# Altium project TSMCN16-Test-PCB-V1.PrjPcb (part 1 of 2)
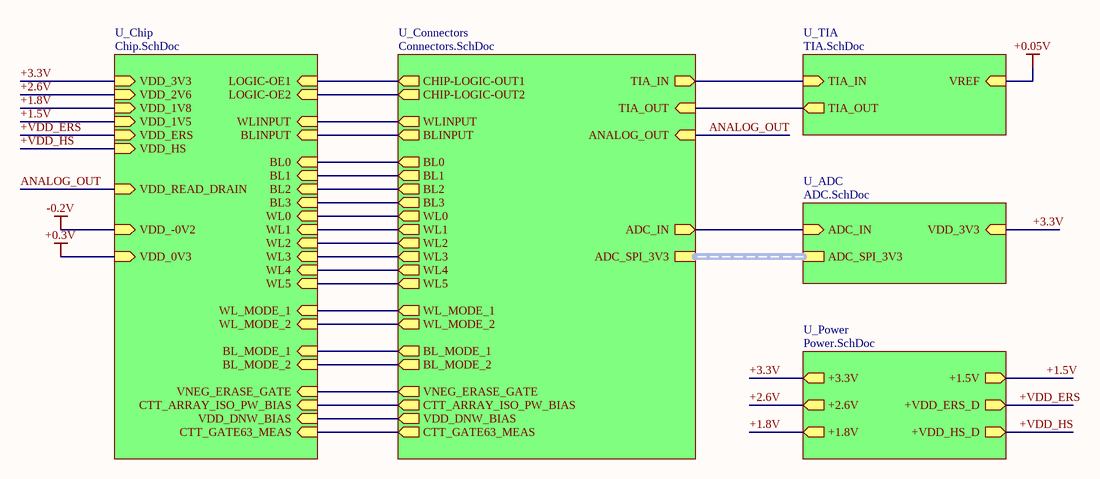
[diagram p0: Root.SchDoc]
CAGE_CODE: ?????; CONTRACT_NUMBER: <CONTRACT NO>; DOC_NO_ASSY_DWG: <ASSY DWG NO>; DOC_NO_BOM: <BOM DOC NO>; DOC_NO_FAB_DWG: <FAB DWG NO>; DOC_NO_SCH_DWG: <SCH DWG NO>; PCB_2_DEC_TOL: +/-.01; PCB_3_DEC_TOL: +/-.010; PCB_ANG_TOL: +/-1/2; PCB_ASSEMBLY_NO: <PCB ASSY NO>; PCB_CHECKER: - -----; PCB_CHECKER_APP_DATE: --/--/----; PCB_DESIGNER: - -----; PCB_DESIGNER_APP_DATE: --/--/----; PCB_DWG_NO: <PCB DWG NO>; PCB_ENGINEER: - -----; PCB_ENGINEER_APP_DATE: --/--/----; PCB_PART_NUMBER: <PCB PN>; PCB_REV: A; SCH_REV: A
8 sheets, 317 parts. Net scope: hierarchical (ports join the sheet entries above them; power ports are global).
Board file: PCB1.PcbDoc
Sheets:
  Root.SchDoc
    U_TIA = TIA.SchDoc
    U_Connectors = Connectors.SchDoc
    U_ADC = ADC.SchDoc
    U_Power = Power.SchDoc
      U_LDO = LDO.SchDoc
      U_LDO = LDO.SchDoc
      U_LDO = LDO.SchDoc
      U_LDO = LDO.SchDoc
      U_LDO = LDO.SchDoc
      U_LDO = LDO.SchDoc
    U_Chip = Chip.SchDoc
      U_ESD-0.8V = ESD-0.8V.SchDoc
      U_ESD-0.8V = ESD-0.8V.SchDoc
      U_ESD-0.8V = ESD-0.8V.SchDoc
      U_ESD-0.8V = ESD-0.8V.SchDoc

## Sheet Root.SchDoc
size A; SheetNumber: 1; SheetTotal: 8

### Sub-sheets
U_ADC = ADC.SchDoc: ADC_IN (in), VDD_3V3 (in), ADC_SPI_3V3 (harness ADC_SPI_3V3)
U_Chip = Chip.SchDoc: BL0 (in), BL1 (in), BL2 (in), BL3 (in), WL0 (in), WL1 (in), WL2 (in), WL3 (in), WL4 (in), WL5 (in), BL_MODE_2 (in), BL_MODE_1 (in), WL_MODE_2 (in), WL_MODE_1 (in), WLINPUT (in), BLINPUT (in), LOGIC-OE1 (in), LOGIC-OE2 (in), VDD_HS (in), VDD_ERS (in), VDD_1V5 (in), VDD_1V8 (in), VDD_2V6 (in), VDD_3V3 (in), VNEG_ERASE_GATE (in), CTT_ARRAY_ISO_PW_BIAS (in), CTT_GATE63_MEAS (in), VDD_DNW_BIAS (in), VDD_READ_DRAIN (in), VDD_-0V2 (in), VDD_0V3 (in)
U_Connectors = Connectors.SchDoc: BL0 (out), BL1 (out), WL0 (out), WL1 (out), WL2 (out), WL3 (out), WL4 (out), WL5 (out), BL2 (out), BL3 (out), BL_MODE_2 (out), BL_MODE_1 (out), WL_MODE_2 (out), WL_MODE_1 (out), TIA_IN (out), CHIP-LOGIC-OUT1 (out), CHIP-LOGIC-OUT2 (out), WLINPUT (out), BLINPUT (out), ADC_IN (out), TIA_OUT (in), ANALOG_OUT (in), VNEG_ERASE_GATE (out), CTT_ARRAY_ISO_PW_BIAS (out), CTT_GATE63_MEAS (out), VDD_DNW_BIAS (out), ADC_SPI_3V3 (harness ADC_SPI_3V3)
U_Power = Power.SchDoc: +1.5V (out), +1.8V (out), +2.6V (out), +3.3V (out), +VDD_ERS_D (out), +VDD_HS_D (out)
U_TIA = TIA.SchDoc: TIA_IN (in), VREF (in), TIA_OUT (out)

### Nets
+1.5V: sheet U_Power/+1.5V, sheet U_Chip/VDD_1V5
+1.8V: sheet U_Power/+1.8V, sheet U_Chip/VDD_1V8
+2.6V: sheet U_Power/+2.6V, sheet U_Chip/VDD_2V6
+3.3V: sheet U_ADC/VDD_3V3, sheet U_Power/+3.3V, sheet U_Chip/VDD_3V3
+VDD_ERS: sheet U_Power/+VDD_ERS_D, sheet U_Chip/VDD_ERS
+VDD_HS: sheet U_Power/+VDD_HS_D, sheet U_Chip/VDD_HS
ADC_IN: sheet U_Connectors/ADC_IN, sheet U_ADC/ADC_IN
ANALOG_OUT: sheet U_Connectors/ANALOG_OUT, sheet U_Chip/VDD_READ_DRAIN
VDD_DNW_B: sheet U_Connectors/VDD_DNW_BIAS, sheet U_Chip/VDD_DNW_BIAS
NetC1_1: sheet U_TIA/TIA_IN, sheet U_Connectors/TIA_IN
NetC20_2: sheet U_Connectors/CTT_ARRAY_ISO_PW_BIAS, sheet U_Chip/CTT_ARRAY_ISO_PW_BIAS
NetC44_2: sheet U_Connectors/VNEG_ERASE_GATE, sheet U_Chip/VNEG_ERASE_GATE
NetC50_2: sheet U_Connectors/CTT_GATE63_MEAS, sheet U_Chip/CTT_GATE63_MEAS
NetJ6_2: sheet U_Connectors/WLINPUT, sheet U_Chip/WLINPUT
NetJ6_4: sheet U_Connectors/BLINPUT, sheet U_Chip/BLINPUT
NetJ6_6: sheet U_Connectors/BL0, sheet U_Chip/BL0
NetJ6_8: sheet U_Connectors/BL1, sheet U_Chip/BL1
NetJ7_2: sheet U_Connectors/BL2, sheet U_Chip/BL2
NetJ7_4: sheet U_Connectors/BL3, sheet U_Chip/BL3
NetJ7_6: sheet U_Connectors/WL0, sheet U_Chip/WL0
NetJ7_8: sheet U_Connectors/WL1, sheet U_Chip/WL1
NetJ8_1: sheet U_Connectors/BL_MODE_2, sheet U_Chip/BL_MODE_2
NetJ8_3: sheet U_Connectors/BL_MODE_1, sheet U_Chip/BL_MODE_1
NetJ8_5: sheet U_Connectors/WL_MODE_2, sheet U_Chip/WL_MODE_2
NetJ8_7: sheet U_Connectors/WL_MODE_1, sheet U_Chip/WL_MODE_1
NetJ9_1: sheet U_Connectors/WL5, sheet U_Chip/WL5
NetJ9_3: sheet U_Connectors/WL4, sheet U_Chip/WL4
NetJ9_5: sheet U_Connectors/WL3, sheet U_Chip/WL3
NetJ9_7: sheet U_Connectors/WL2, sheet U_Chip/WL2
NetJ29_2: sheet U_TIA/TIA_OUT, sheet U_Connectors/TIA_OUT
NetJ30_1: sheet U_Connectors/CHIP-LOGIC-OUT1, sheet U_Chip/LOGIC-OE1
NetJ31_1: sheet U_Connectors/CHIP-LOGIC-OUT2, sheet U_Chip/LOGIC-OE2

### Buses and harness runs
harness sheet U_ADC/ADC_SPI_3V3 = sheet U_Connectors/ADC_SPI_3V3

## Sheet TIA.SchDoc
size A; SheetNumber: 2; SheetTotal: 8
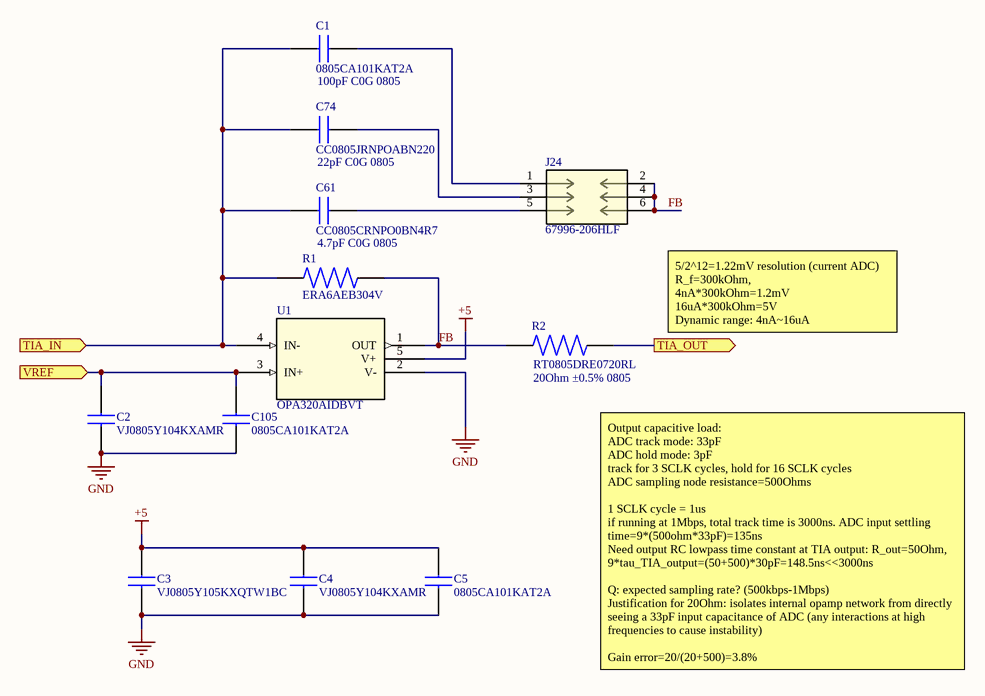
[diagram p1: TIA.SchDoc]

### Parts
C1  0805CA101KAT2A  [CAPC2112X94N]
C2  VJ0805Y104KXAMR  [CAPC2012X145N]
C3  VJ0805Y105KXQTW1BC  [CAPC2012X135N]
C4  VJ0805Y104KXAMR  [CAPC2012X145N]
C5  0805CA101KAT2A  [CAPC2112X94N]
C61  CC0805CRNPO0BN4R7  [CAP_CC0805_YAG]
C74  CC0805JRNPOABN220  [CAP_CC0805_YAG]
C105  0805CA101KAT2A  [CAPC2112X94N]
J24  67996-206HLF  [67996-206HLF_AMP]
R1  ERA6AEB304V  [RES_ERA6AEB304V]
R2  RT0805DRE0720RL  [RC0805N_YAG]
U1  OPA320AIDBVT  [DBV5]

### Ports
TIA_IN (in), TIA_OUT (out), VREF (in)

### Nets
+0.05V: C2.2 C105.2 U1.3(IN+) ; port VREF
+5: C3.2 C4.2 C5.2 U1.5(V+)  [project net VDD_5V]
GND: C2.1 C3.1 C4.1 C5.1 C105.1 U1.2(V-)  [project net CHIPS_VSS]
FB: J24.2 J24.4 J24.6 R1.2 R2.1 U1.1(OUT)
NetC1_1: C1.1 C61.1 C74.1 R1.1 U1.4(IN-) ; port TIA_IN
NetC1_2: C1.2 J24.1
NetC61_2: C61.2 J24.5
NetC74_2: C74.2 J24.3
NetJ29_2: R2.2 ; port TIA_OUT

### Notes on the sheet
- 100pF C0G 0805
- 22pF C0G 0805
- 4.7pF C0G 0805
- 5/2^12=1.22mV resolution (current ADC)
  R_f=300kOhm,
  4nA*300kOhm=1.2mV
  16uA*300kOhm=5V
  Dynamic range: 4nA~16uA
- (near R2) 20Ohm ±0.5% 0805
- Output capacitive load:
  ADC track mode: 33pF
  ADC hold mode: 3pF
  track for 3 SCLK cycles, hold for 16 SCLK cycles
  ADC sampling node resistance=500Ohms
  1 SCLK cycle = 1us
  if running at 1Mbps, total track time is 3000ns. ADC input settling time=9*(500ohm*33pF)=135ns
  Need output RC lowpass time constant at TIA output: R_out=50Ohm, 9*tau_TIA_output=(50+500)*30pF=148.5ns<<3000ns
  Q: expected sampling rate? (500kbps-1Mbps)
  Justification for 20Ohm: isolates internal opamp network from directly seeing a 33pF input capacitance of ADC (any interactions at high frequencies to cause instability)
  Gain error=20/(20+500)=3.8%

### Library data of the parts
C1 C5 C105 = 0805CA101KAT2A: 100 pF +/-10% 1000V (1kV) Ceramic Capacitor C0G, NP0 0805 (2012 Metric); Manufacturer_Name: Kyocera AVX; Geometry.Height: 0.94mm; Mouser Part Number: 581-0805CA101KAT2A; Mouser Price/Stock: https://www.mouser.co.uk/ProductDetail/KYOCERA-AVX/0805CA101KAT2A?qs=ZBeOGGPQgEHtR%2FQeWT8jmQ%3D%3D; Manufacturer_Part_Number: 0805CA101KAT2A; Datasheet Link: https://datasheets.kyocera-avx.com/AVX-HV_MLCC.pdf
C2 C4 = VJ0805Y104KXAMR: Multilayer Ceramic Capacitors MLCC - SMD/SMT 0805 0.1uF 50volts X7R 10%; Manufacturer_Name: Vishay; Geometry.Height: 1.45mm; Mouser Part Number: 77-VJ0805Y104KXAMR; Mouser Price/Stock: https://www.mouser.co.uk/ProductDetail/Vishay-Vitramon/VJ0805Y104KXAMR?qs=iPOr8XgPdiSpDWrmTedxnA%3D%3D; Manufacturer_Part_Number: VJ0805Y104KXAMR; Datasheet Link: http://www.vishay.com/docs/45226/vj31xrohsautomlcc.pdf
C3 = VJ0805Y105KXQTW1BC: 1 µF ±10% 10V Ceramic Capacitor X7R 0805 (2012 Metric); Manufacturer_Name: Vishay; Geometry.Height: 1.35mm; Mouser Part Number: 77-VJ0805Y105KXQTBC; Mouser Price/Stock: https://www.mouser.co.uk/ProductDetail/Vishay-Vitramon/VJ0805Y105KXQTW1BC?qs=F2lBERbFaaHnNHh23%2Flzkg%3D%3D; Manufacturer_Part_Number: VJ0805Y105KXQTW1BC; Datasheet Link: https://www.vishay.com/docs/28548/vjw1bcbascomseries.pdf
C61 = CC0805CRNPO0BN4R7: 4.7 pF ±0.25pF 100V Ceramic Capacitor C0G, NP0 0805 (2012 Metric); Manufacturer_Name: Yageo; Copyright: Copyright (C) 2026 Ultra Librarian. All rights reserved.; Manufacturer_Part_Number: CC0805CRNPO0BN4R7
C74 = CC0805JRNPOABN220: 22 pF ±5% 200V Ceramic Capacitor C0G, NP0 0805 (2012 Metric); Manufacturer_Name: Yageo; Copyright: Copyright (C) 2026 Ultra Librarian. All rights reserved.; Manufacturer_Part_Number: CC0805JRNPOABN220
J24 = 67996-206HLF: Connector Header Through Hole 6 position 0.100" (2.54mm); Manufacturer_Name: Amphenol ICC; Copyright: Copyright (C) 2025 Ultra Librarian. All rights reserved.; Manufacturer_Part_Number: 67996-206HLF; RefDes: RefDes; Type: Type
R1 = ERA6AEB304V: RES SMD 300K OHM 0.1% 1/8W 0805; Availability: Unavailable; MP: ERA6AEB304V; Value: *; Price: None; Package: None; ComponentLink1Description: Digikey link; ComponentLink1URL: https://www.digikey.com/en/products/detail/panasonic-industry/ERA-6AEB304V/1465808
R2 = RT0805DRE0720RL: 20 Ohms ±0.5% 0.125W, 1/8W Chip Resistor 0805 (2012 Metric) Thin Film; Manufacturer_Name: Yageo; Copyright: Copyright (C) 2026 Ultra Librarian. All rights reserved.; Manufacturer_Part_Number: RT0805DRE0720RL
U1 = OPA320AIDBVT: Precision, zero-crossover, 20-MHz, 0.9-pA Ib, RRIO, CMOS operational amplifier 5-SOT-23 -40 to 125; Manufacturer_Name: Texas Instruments; Copyright: Copyright (C) 2025 Ultra Librarian. All rights reserved.; Manufacturer_Part_Number: OPA320AIDBVT; RefDes: RefDes; Type: Type

## Sheet Connectors.SchDoc
size B; SheetNumber: 3; SheetTotal: 8
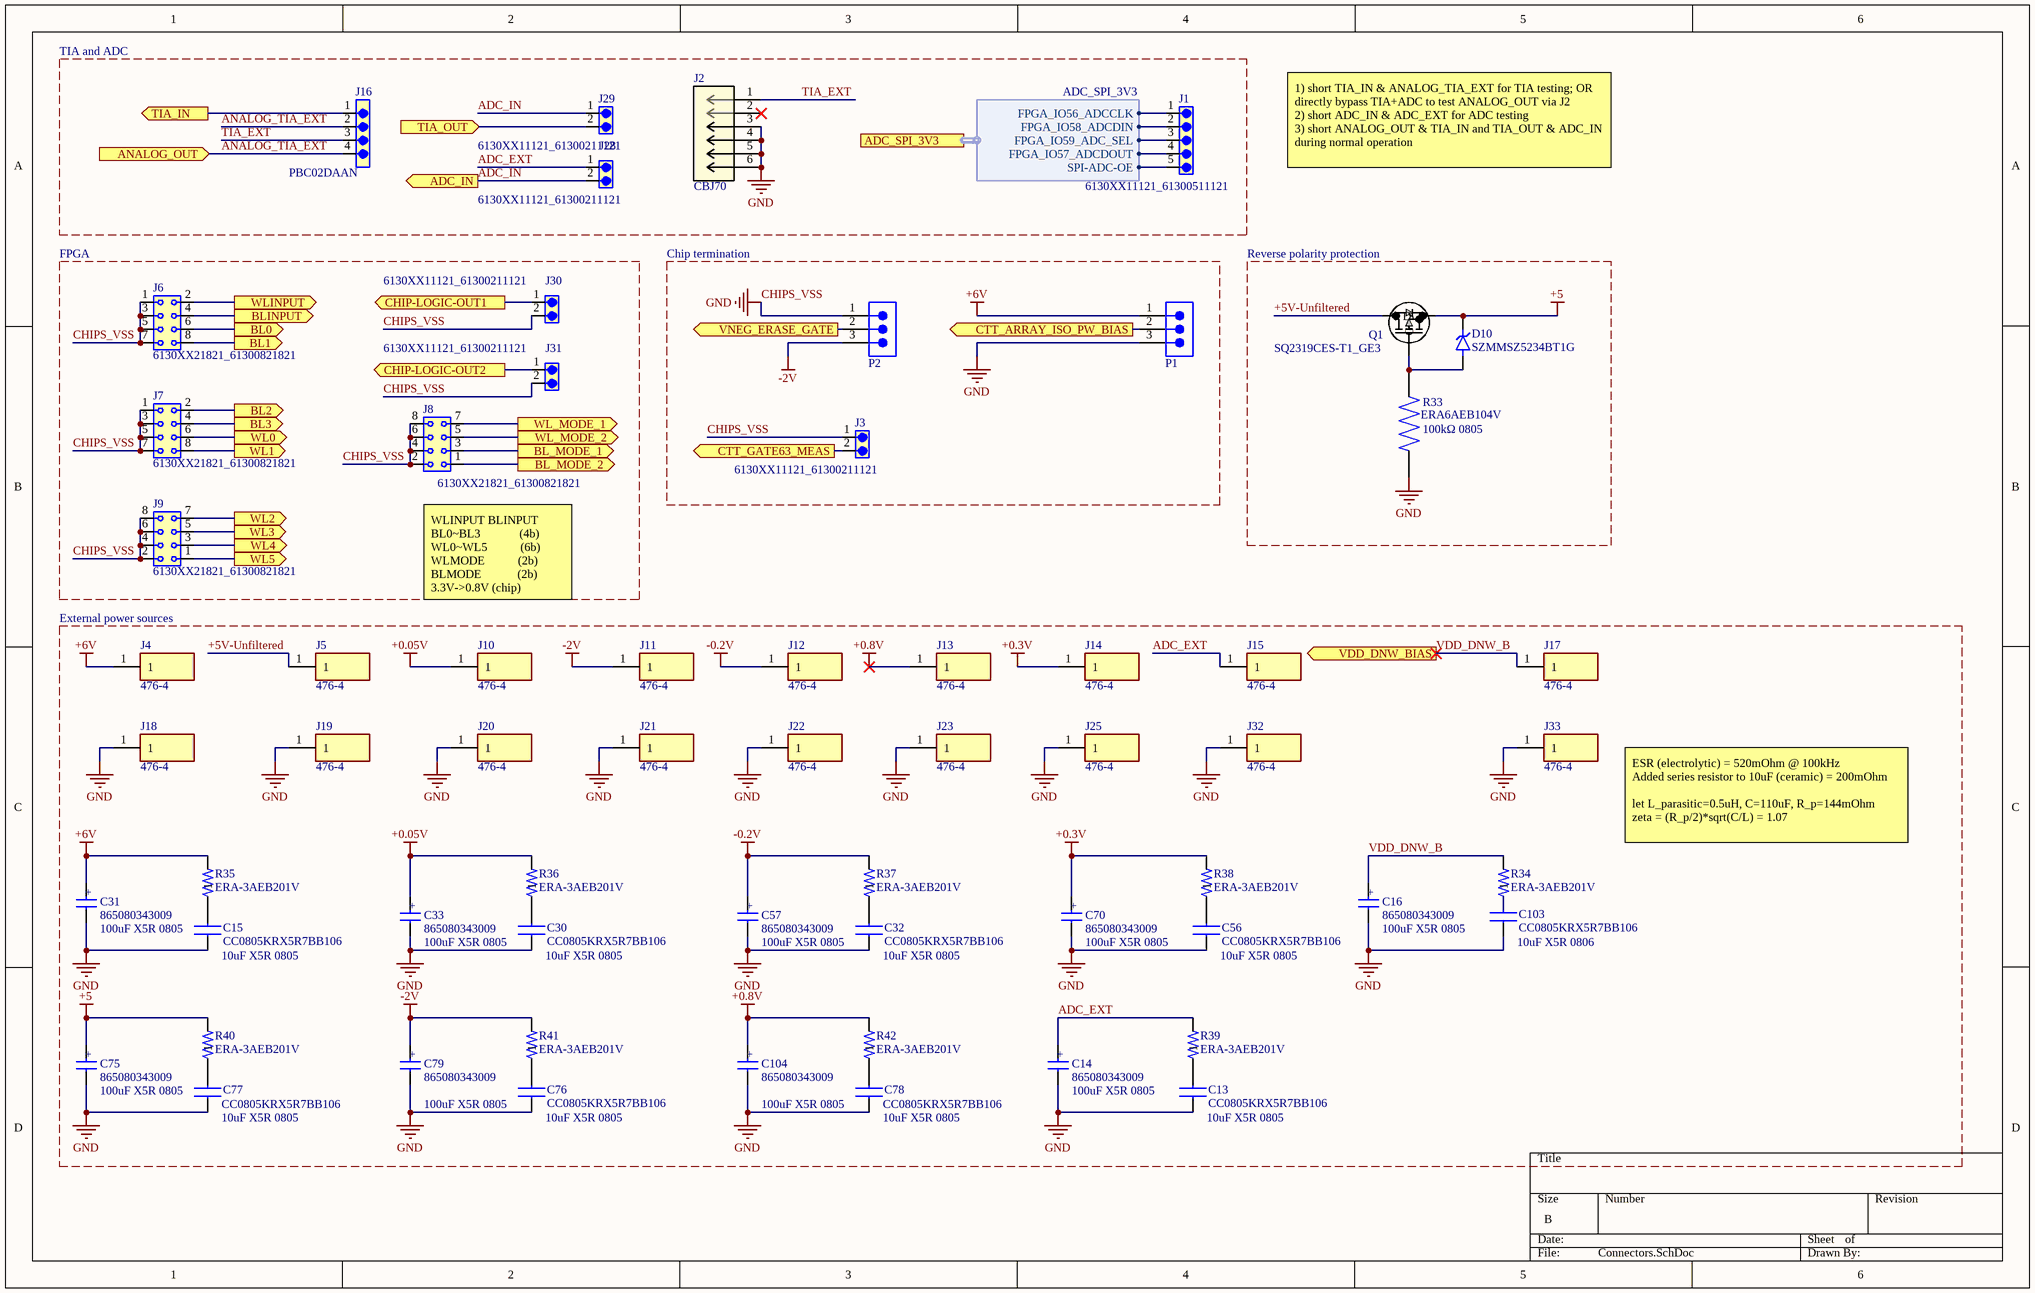
[diagram p2: Connectors.SchDoc]

### Parts
C13  CC0805KRX5R7BB106  [CAP_CC0805_YAG]
C14  865080343009  [WCAP-ASLI_6.3X5.5(DXL)]
C15  CC0805KRX5R7BB106  [CAP_CC0805_YAG]
C16  865080343009  [WCAP-ASLI_6.3X5.5(DXL)]
C30  CC0805KRX5R7BB106  [CAP_CC0805_YAG]
C31  865080343009  [WCAP-ASLI_6.3X5.5(DXL)]
C32  CC0805KRX5R7BB106  [CAP_CC0805_YAG]
C33  865080343009  [WCAP-ASLI_6.3X5.5(DXL)]
C56  CC0805KRX5R7BB106  [CAP_CC0805_YAG]
C57  865080343009  [WCAP-ASLI_6.3X5.5(DXL)]
C70  865080343009  [WCAP-ASLI_6.3X5.5(DXL)]
C75  865080343009  [WCAP-ASLI_6.3X5.5(DXL)]
C76  CC0805KRX5R7BB106  [CAP_CC0805_YAG]
C77  CC0805KRX5R7BB106  [CAP_CC0805_YAG]
C78  CC0805KRX5R7BB106  [CAP_CC0805_YAG]
C79  865080343009  [WCAP-ASLI_6.3X5.5(DXL)]
C103  CC0805KRX5R7BB106  [CAP_CC0805_YAG]
C104  865080343009  [WCAP-ASLI_6.3X5.5(DXL)]
D10  SZMMSZ5234BT1G  [DIO_SZMMSZ5234BT1G]
J1  6130XX11121_61300511121  [61300511121]
J2  CBJ70  [CONN_CBJ70_CIN]
J3  6130XX11121_61300211121  [61300211121]
J4  476-4  [4764]
J5  476-4  [4764]
J6  6130XX21821_61300821821  [61300821821]
J7  6130XX21821_61300821821  [61300821821]
J8  6130XX21821_61300821821  [61300821821]
J9  6130XX21821_61300821821  [61300821821]
J10  476-4  [4764]
J11  476-4  [4764]
J12  476-4  [4764]
J13  476-4  [4764]
J14  476-4  [4764]
J15  476-4  [4764]
J16  PBC02DAAN  [CONN4_DAAN_SUL]
J17  476-4  [4764]
J18  476-4  [4764]
J19  476-4  [4764]
J20  476-4  [4764]
J21  476-4  [4764]
J22  476-4  [4764]
J23  476-4  [4764]
J25  476-4  [4764]
J28  6130XX11121_61300211121  [61300211121]
J29  6130XX11121_61300211121  [61300211121]
J30  6130XX11121_61300211121  [61300211121]
J31  6130XX11121_61300211121  [61300211121]
J32  476-4  [4764]
J33  476-4  [4764]
P1  61300311121  [61300311121]  (value not drawn)
P2  61300311121  [61300311121]  (value not drawn)
Q1  SQ2319CES-T1_GE3  [PMOSGSD_SOT-23_TO-236_VIS]
R33  ERA6AEB104V  [RES_ERA6AEB104V]
R34  ERA-3AEB201V  [RES_ERA3AEB201V]
R35  ERA-3AEB201V  [RES_ERA3AEB201V]
R36  ERA-3AEB201V  [RES_ERA3AEB201V]
R37  ERA-3AEB201V  [RES_ERA3AEB201V]
R38  ERA-3AEB201V  [RES_ERA3AEB201V]
R39  ERA-3AEB201V  [RES_ERA3AEB201V]
R40  ERA-3AEB201V  [RES_ERA3AEB201V]
R41  ERA-3AEB201V  [RES_ERA3AEB201V]
R42  ERA-3AEB201V  [RES_ERA3AEB201V]

### Blocks framed on the sheet
TIA and ADC: J1 J2 J16 J28 J29
FPGA: J6-J9 J30 J31
Chip termination: J3 P1 P2

### Ports
ADC_IN (out), ADC_SPI_3V3 (harness ADC_SPI_3V3), ANALOG_OUT (in), BL0 (out), BL1 (out), BL2 (out), BL3 (out), BL_MODE_1 (out), BL_MODE_2 (out), BLINPUT (out), CHIP-LOGIC-OUT1 (out), CHIP-LOGIC-OUT2 (out), CTT_ARRAY_ISO_PW_BIAS (out), CTT_GATE63_MEAS (out), TIA_IN (out), TIA_OUT (in), VDD_DNW_BIAS (out), VNEG_ERASE_GATE (out), WL0 (out), WL1 (out), WL2 (out), WL3 (out), WL4 (out), WL5 (out), WL_MODE_1 (out), WL_MODE_2 (out), WLINPUT (out)

### Harnesses
ADC_SPI_3V3: FPGA_IO56_ADCCLK, FPGA_IO59_ADC_SEL, SPI-ADC-OE, FPGA_IO58_ADCDIN, FPGA_IO57_ADCDOUT

### Nets
+0.3V: C70.1(POS) J14.1 R38.2
+0.05V: C33.1(POS) J10.1 R36.2
+0.8V: C104.1(POS) J13.1 R42.2
+5: C75.1(POS) D10.1(K) Q1.2(S) R40.2  [project net VDD_5V]
+6V: C31.1(POS) J4.1 P1.1 R35.2
-0.2V: C57.1(POS) J12.1 R37.2
-2V: C79.1(POS) J11.1 P2.3 R41.2
CHIPS_VSS: C13.1 C14.2(NEG) C15.1 C16.2(NEG) C30.1 C31.2(NEG) C32.1 C33.2(NEG) C56.1 C57.2(NEG) C70.2(NEG) C75.2(NEG) C76.1 C77.1 C78.1 C79.2(NEG) C103.1 C104.2(NEG) J2.3 J2.4 J2.5 J2.6 J3.1 J6.1 J6.3 J6.5 J6.7 J7.1 J7.3 J7.5 J7.7 J8.2 J8.4 J8.6 J8.8 J9.2 J9.4 J9.6 J9.8 J18.1 J19.1 J20.1 J21.1 J22.1 J23.1 J25.1 J30.2 J31.2 J32.1 J33.1 P1.3 P2.1 R33.1  [also labelled GND]
+5V-Unfiltered: J5.1 Q1.3(D)
ADC_EXT: C14.1(POS) J15.1 J28.1 R39.2
ADC_IN: J28.2 J29.1 ; port ADC_IN
ANALOG_TIA_EXT: J16.2 J16.4 ; port ANALOG_OUT  [project net ANALOG_OUT]
TIA_EXT: J2.1 J16.3
VDD_DNW_B: C16.1(POS) J17.1 R34.2 ; port VDD_DNW_BIAS
NetB2_2: J1.1 ; port ADC_SPI_3V3.FPGA_IO56_ADCCLK
NetB2_3: J1.2 ; port ADC_SPI_3V3.FPGA_IO58_ADCDIN
NetB2_4: J1.3 ; port ADC_SPI_3V3.FPGA_IO59_ADC_SEL
NetB2_5: J1.4 ; port ADC_SPI_3V3.FPGA_IO57_ADCDOUT
NetB2_8: J1.5 ; port ADC_SPI_3V3.SPI-ADC-OE
NetC1_1: J16.1 ; port TIA_IN
NetC13_2: C13.2 R39.1
NetC15_2: C15.2 R35.1
NetC20_2: P1.2 ; port CTT_ARRAY_ISO_PW_BIAS
NetC30_2: C30.2 R36.1
NetC32_2: C32.2 R37.1
NetC44_2: P2.2 ; port VNEG_ERASE_GATE
NetC50_2: J3.2 ; port CTT_GATE63_MEAS
NetC56_2: C56.2 R38.1
NetC76_2: C76.2 R41.1
NetC77_2: C77.2 R40.1
NetC78_2: C78.2 R42.1
NetC103_2: C103.2 R34.1
NetD10_2: D10.2(A) Q1.1(G) R33.2
NetJ6_2: J6.2 ; port WLINPUT
NetJ6_4: J6.4 ; port BLINPUT
NetJ6_6: J6.6 ; port BL0
NetJ6_8: J6.8 ; port BL1
NetJ7_2: J7.2 ; port BL2
NetJ7_4: J7.4 ; port BL3
NetJ7_6: J7.6 ; port WL0
NetJ7_8: J7.8 ; port WL1
NetJ8_1: J8.1 ; port BL_MODE_2
NetJ8_3: J8.3 ; port BL_MODE_1
NetJ8_5: J8.5 ; port WL_MODE_2
NetJ8_7: J8.7 ; port WL_MODE_1
NetJ9_1: J9.1 ; port WL5
NetJ9_3: J9.3 ; port WL4
NetJ9_5: J9.5 ; port WL3
NetJ9_7: J9.7 ; port WL2
NetJ29_2: J29.2 ; port TIA_OUT
NetJ30_1: J30.1 ; port CHIP-LOGIC-OUT1
NetJ31_1: J31.1 ; port CHIP-LOGIC-OUT2

Not connected (* = marked no-connect by the designer): J2 2*

### Notes on the sheet
- 1) short TIA_IN & ANALOG_TIA_EXT for TIA testing; OR directly bypass TIA+ADC to test ANALOG_OUT via J2
  2) short ADC_IN & ADC_EXT for ADC testing
  3) short ANALOG_OUT & TIA_IN and TIA_OUT & ADC_IN during normal operation
- Reverse polarity protection
- (near R33) 100kΩ 0805
- External power sources
- (near J8) WLINPUT BLINPUT
  BL0~BL3             (4b)
  WL0~WL5           (6b)
  WLMODE           (2b)
  BLMODE            (2b)
  3.3V->0.8V (chip)
- ESR (electrolytic) = 520mOhm @ 100kHz
  Added series resistor to 10uF (ceramic) = 200mOhm
  let L_parasitic=0.5uH, C=110uF, R_p=144mOhm
  zeta = (R_p/2)*sqrt(C/L) = 1.07
- 100uF X5R 0805
- (near C15) 10uF X5R 0805
- (near C30) 10uF X5R 0805
- (near C32) 10uF X5R 0805
- (near C70) 100uF X5R 0805
- (near C56) 10uF X5R 0805
- (near C16) 100uF X5R 0805
- (near C103) 10uF X5R 0806
- (near C14) 100uF X5R 0805
- (near C77) 10uF X5R 0805
- (near C76) 10uF X5R 0805
- (near C78) 10uF X5R 0805
- (near C13) 10uF X5R 0805
- (in symbol WCAP-ASLI_6.3X5.5) +

### Library data of the parts
C13 C15 C30 C32 C56 C76-C78 C103 = CC0805KRX5R7BB106: 10 µF ±10% 16V Ceramic Capacitor X5R 0805 (2012 Metric); Manufacturer_Name: Yageo; Copyright: Copyright (C) 2025 Ultra Librarian. All rights reserved.; Manufacturer_Part_Number: CC0805KRX5R7BB106
C14 C16 C31 C33 C57 C70 C75 C79 C104 = WCAP-ASLI_6.3X5.5: 100 µF 16 V Aluminum Electrolytic Capacitors Radial, Can - SMD 2000 Hrs @ 105°C; MF: {'manufacturer': u'W\xfcrth Elektronik'}; Package: None; Price: None; Value: *; MP: 865080343009; Availability: Unavailable
D10 = SZMMSZ5234BT1G: Zener Diode 6.2 V 500 mW ±5% Surface Mount SOD-123; MF: {'manufacturer': u'onsemi'}; Package: None; Price: None; Value: *; MP: SZMMSZ5234BT1G; Availability: Unavailable
J1 = 6130XX11121_61300511121: MF: {'manufacturer': u'W\xfcrth Elektronik'}; Package: None; Price: None; Value: *; MP: 61300511121; Availability: Unavailable
J2 = CBJ70: Description; Manufacturer_Name: Cinch Connectivity Solutions; Copyright: Copyright (C) 2025 Ultra Librarian. All rights reserved.; Manufacturer_Part_Number: CBJ70; RefDes: RefDes; Type: Type
J3 J28-J31 = 6130XX11121_61300211121: MF: {'manufacturer': u'Wurth Electronics'}; Package: None; Price: None; Value: *; MP: 61300211121; Availability: Unavailable; ComponentLink1Description: Digikey link; ComponentLink1URL: https://www.digikey.com/en/products/detail/w%C3%BCrth-elektronik/61300211121/4846823
J4 J5 J10-J15 J17-J23 J25 J32 J33 = 476-4: Banana Jack Connector Miniature Solder; Manufacturer_Name: Keystone Electronics; Geometry.Height: 6.66mm; Mouser Part Number: 534-476-4; Mouser Price/Stock: https://www.mouser.co.uk/ProductDetail/Keystone-Electronics/476-4?qs=w4ABFRoM%2FL8IE7UmBO5PGw%3D%3D; Manufacturer_Part_Number: 476-4; Datasheet Link: https://www.digikey.com/en/products/detail/keystone-electronics/476-4/318477
J6-J9 = 6130XX21821_61300821821: WR-PHD 2.54 MM DUAL SOCKET HEADE; MF: WÃ¼rth Elektronik; SnapEDA_Link: https://www.snapeda.com/parts/61300821821/W%25C3%25BCrth+Elektronik+Midcom/view-part/?ref=snap; Package: None; Value: *; MP: 61300821821; Check_prices: https://www.snapeda.com/parts/61300821821/W%25C3%25BCrth+Elektronik+Midcom/view-part/?ref=eda
J16 = PBC02DAAN: Connector Header Through Hole 4 position 0.100" (2.54mm); Manufacturer_Name: Sullins; Copyright: Copyright (C) 2026 Ultra Librarian. All rights reserved.; Manufacturer_Part_Number: PBC02DAAN; RefDes: RefDes; Type: Type
P1 P2 = 61300311121: WR-PHD Pin Header, THT, Vertical, pitch 2.54mm, 1 Row, 3P; Manufacturer: Wurth Elektronik; Contact Resistance: 20mOhm; Rated Current: 3A; Working Voltage: 250V; Withstanding Voltage: 500V; Manufacturer Part Number: 61300311121; Category: Board-to-Board Connectors; Match Code: WR-PHD; ComponentLink1Description: Website Link; ComponentLink1URL: https://www.we-online.com/redexpert/article/61300311121?ad; ComponentLink2Description: Datasheet Link; ComponentLink2URL: https://www.we-online.com/redexpert/spec/61300311121?ad; Mount: Through Hole; Operating Temperature Max: 105°C; Operating Temperature Min: -40°C; Packaging: Bag; Gender: Pin Header; Number of Pins: 3; Number of Rows: 1; Orientation: Vertical; Pitch: 2.54mm
Q1 = SQ2319CES-T1_GE3: P-CHANNEL 40-V (D-S) MOSFET; Manufacturer_Name: Vishay; Copyright: Copyright (C) 2025 Ultra Librarian. All rights reserved.; Manufacturer_Part_Number: SQ2319CES-T1_GE3
R33 = ERA6AEB104V: 100 kOhms ±0.1% 0.125W, 1/8W Chip Resistor 0805 (2012 Metric) Automotive AEC-Q200 Thin Film; Price: None; Value: *; Availability: Unavailable; MP: ERA6AEB104V; Package: None
R34-R42 = ERA3AEB201V: 200 Ohms ±0.1% 0.1W, 1/10W Chip Resistor 0603 (1608 Metric) Automotive AEC-Q200 Thin Film; Package: None; Availability: Unavailable; Price: None; MP: ERA3AEB201V; Value: *

## Sheet ADC.SchDoc
size A; SheetNumber: 4; SheetTotal: 8
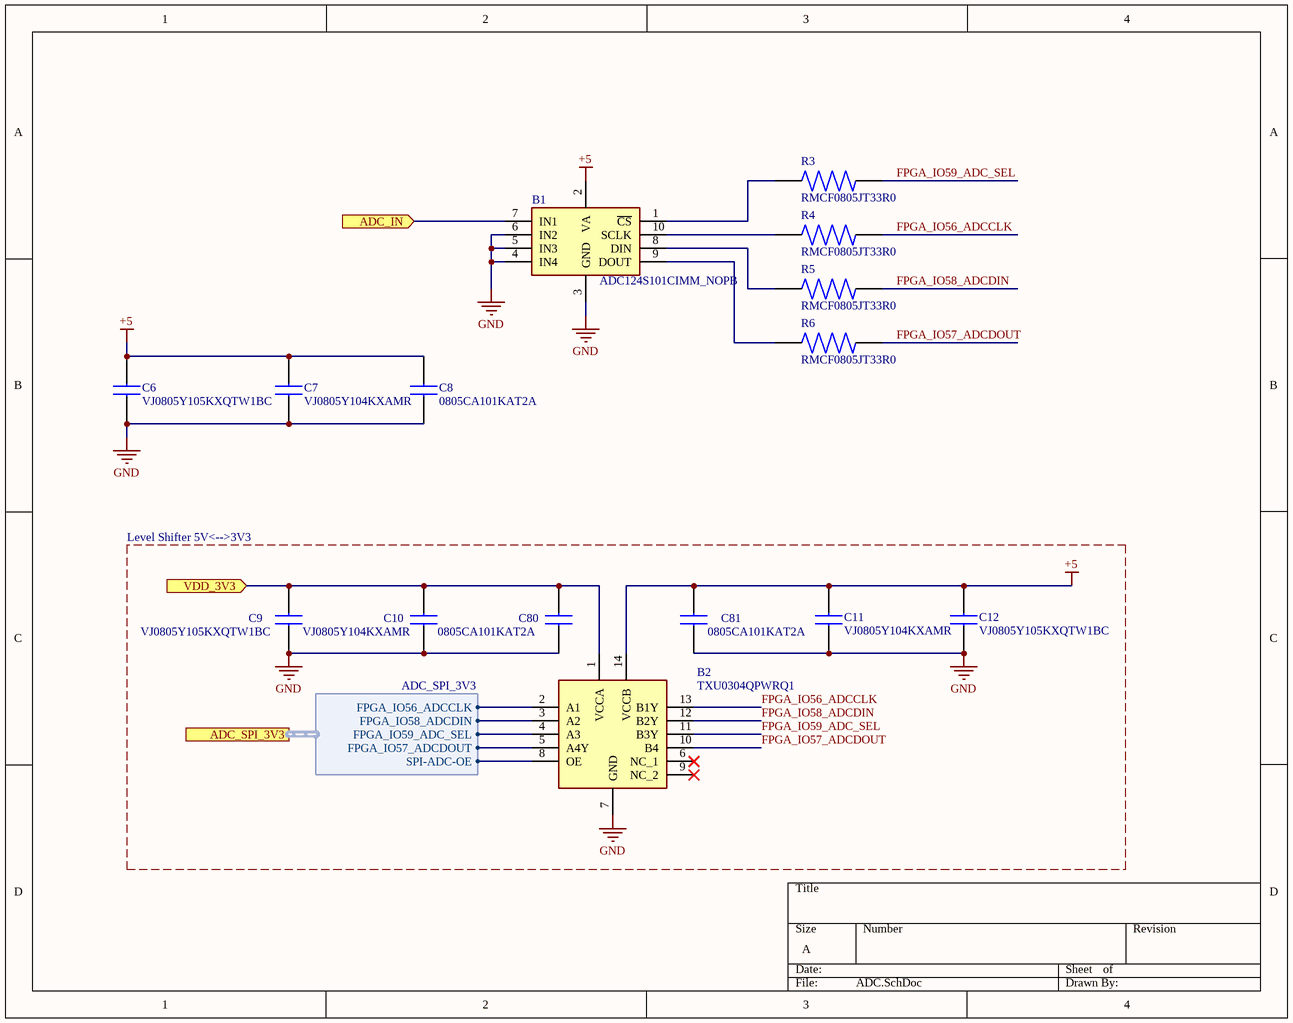
[diagram p3: ADC.SchDoc]

### Parts
B1  ADC124S101CIMM_NOPB  [SOP50P490X110-10N]
B2  TXU0304QPWRQ1  [SOP65P640X120-14N]
C6  VJ0805Y105KXQTW1BC  [CAPC2012X135N]
C7  VJ0805Y104KXAMR  [CAPC2012X145N]
C8  0805CA101KAT2A  [CAPC2112X94N]
C9  VJ0805Y105KXQTW1BC  [CAPC2012X135N]
C10  VJ0805Y104KXAMR  [CAPC2012X145N]
C11  VJ0805Y104KXAMR  [CAPC2012X145N]
C12  VJ0805Y105KXQTW1BC  [CAPC2012X135N]
C80  0805CA101KAT2A  [CAPC2112X94N]
C81  0805CA101KAT2A  [CAPC2112X94N]
R3  RMCF0805JT33R0  [STA_RMCF0805_STP]
R4  RMCF0805JT33R0  [STA_RMCF0805_STP]
R5  RMCF0805JT33R0  [STA_RMCF0805_STP]
R6  RMCF0805JT33R0  [STA_RMCF0805_STP]

### Blocks framed on the sheet
Level Shifter 5V<-->3V3: B2 C9-C12 C80 C81

### Ports
ADC_IN (in), ADC_SPI_3V3 (harness ADC_SPI_3V3), VDD_3V3 (in)

### Harnesses
ADC_SPI_3V3: FPGA_IO56_ADCCLK, FPGA_IO58_ADCDIN, FPGA_IO57_ADCDOUT, FPGA_IO59_ADC_SEL, SPI-ADC-OE

### Nets
+5: B1.2(VA) B2.14(VCCB) C6.2 C7.2 C8.2 C11.2 C12.2 C81.2  [project net VDD_5V]
GND: B1.3(GND) B1.4(IN4) B1.5(IN3) B1.6(IN2) B2.7(GND) C6.1 C7.1 C8.1 C9.1 C10.1 C11.1 C12.1 C80.1 C81.1  [project net CHIPS_VSS]
+3.3V: B2.1(VCCA) C9.2 C10.2 C80.2 ; port VDD_3V3
ADC_IN: B1.7(IN1) ; port ADC_IN
FPGA_IO56_ADCCLK: B2.13(B1Y) R4.2
FPGA_IO57_ADCDOUT: B2.10(B4) R6.2
FPGA_IO58_ADCDIN: B2.12(B2Y) R5.2
FPGA_IO59_ADC_SEL: B2.11(B3Y) R3.2
NetB1_1: B1.1(~{CS}) R3.1
NetB1_8: B1.8(DIN) R5.1
NetB1_9: B1.9(DOUT) R6.1
NetB1_10: B1.10(SCLK) R4.1
NetB2_2: B2.2(A1) ; port ADC_SPI_3V3.FPGA_IO56_ADCCLK
NetB2_3: B2.3(A2) ; port ADC_SPI_3V3.FPGA_IO58_ADCDIN
NetB2_4: B2.4(A3) ; port ADC_SPI_3V3.FPGA_IO59_ADC_SEL
NetB2_5: B2.5(A4Y) ; port ADC_SPI_3V3.FPGA_IO57_ADCDOUT
NetB2_8: B2.8(OE) ; port ADC_SPI_3V3.SPI-ADC-OE

Not connected (* = marked no-connect by the designer): B2 6(NC_1)* 9(NC_2)*

### Library data of the parts
B1 = ADC124S101CIMM_NOPB: 4 Channel, 500 ksps to 1 Msps, 12-Bit A/D Converter; Manufacturer_Name: Texas Instruments; Manufacturer_Part_Number: ADC124S101CIMM/NOPB; Geometry.Height: 1.1mm; Mouser Part Number: 926-AD124S101CIMMNPB; Mouser Price/Stock: https://www.mouser.co.uk/ProductDetail/Texas-Instruments/ADC124S101CIMM-NOPB?qs=7X5t%252BdzoRHD7V7sCz8DzxQ%3D%3D; Datasheet Link: http://www.ti.com/lit/ds/symlink/adc124s101.pdf
B2 = TXU0304QPWRQ1: Voltage Level Translator Unidirectional 1 Circuit 4 Channel 200Mbps TSSOP-14; Manufacturer_Name: Texas Instruments; Geometry.Height: 1.2mm; Mouser Part Number: 595-TXU0304QPWRQ1; Mouser Price/Stock: https://www.mouser.co.uk/ProductDetail/Texas-Instruments/TXU0304QPWRQ1?qs=QNEnbhJQKvZXfjMNvwmKIA%3D%3D; Manufacturer_Part_Number: TXU0304QPWRQ1; Datasheet Link: https://www.ti.com/lit/ds/symlink/txu0304-q1.pdf
C6 C9 C12 = VJ0805Y105KXQTW1BC: as C3 on sheet TIA; Mouser Part Number: 77-VJ0805Y105KXQTBC; Mouser Price/Stock: https://www.mouser.co.uk/ProductDetail/Vishay-Vitramon/VJ0805Y105KXQTW1BC?qs=F2lBERbFaaHnNHh23%2Flzkg%3D%3D; Manufacturer_Part_Number: VJ0805Y105KXQTW1BC; Datasheet Link: https://www.vishay.com/docs/28548/vjw1bcbascomseries.pdf
C7 C10 C11 = VJ0805Y104KXAMR: as C2 on sheet TIA; Mouser Part Number: 77-VJ0805Y104KXAMR; Mouser Price/Stock: https://www.mouser.co.uk/ProductDetail/Vishay-Vitramon/VJ0805Y104KXAMR?qs=iPOr8XgPdiSpDWrmTedxnA%3D%3D; Manufacturer_Part_Number: VJ0805Y104KXAMR; Datasheet Link: http://www.vishay.com/docs/45226/vj31xrohsautomlcc.pdf
C8 C80 C81 = 0805CA101KAT2A: as C1 on sheet TIA; Mouser Part Number: 581-0805CA101KAT2A; Mouser Price/Stock: https://www.mouser.co.uk/ProductDetail/KYOCERA-AVX/0805CA101KAT2A?qs=ZBeOGGPQgEHtR%2FQeWT8jmQ%3D%3D; Manufacturer_Part_Number: 0805CA101KAT2A; Datasheet Link: https://datasheets.kyocera-avx.com/AVX-HV_MLCC.pdf
R3-R6 = RMCF0805JT33R0: RES 33 OHM 5% 1/8W 0805; Manufacturer_Name: Stackpole International; Copyright: Copyright (C) 2026 Ultra Librarian. All rights reserved.; Manufacturer_Part_Number: RMCF0805JT33R0

## Sheet Power.SchDoc
size A; SheetNumber: 5; SheetTotal: 8
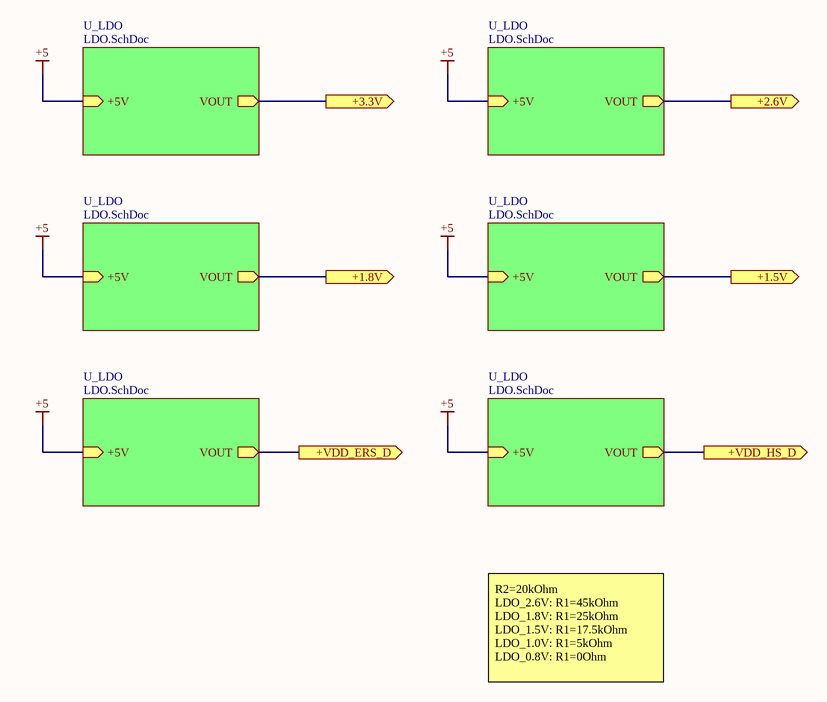
[diagram p4: Power.SchDoc]

### Sub-sheets
U_LDO = LDO.SchDoc: VOUT (out), +5V (in)
U_LDO = LDO.SchDoc: VOUT (out), +5V (in)
U_LDO = LDO.SchDoc: VOUT (out), +5V (in)
U_LDO = LDO.SchDoc: VOUT (out), +5V (in)
U_LDO = LDO.SchDoc: VOUT (out), +5V (in)
U_LDO = LDO.SchDoc: VOUT (out), +5V (in)

### Ports
+1.5V (out), +1.8V (out), +2.6V (out), +3.3V (out), +VDD_ERS_D (out), +VDD_HS_D (out)

### Nets
+5: sheet U_LDO/+5V, sheet U_LDO/+5V, sheet U_LDO/+5V, sheet U_LDO/+5V, sheet U_LDO/+5V, sheet U_LDO/+5V  [project net VDD_5V]
+1.5V: port +1.5V, sheet U_LDO/VOUT
+1.8V: port +1.8V, sheet U_LDO/VOUT
+2.6V: port +2.6V, sheet U_LDO/VOUT
+3.3V: port +3.3V, sheet U_LDO/VOUT
+VDD_ERS: port +VDD_ERS_D, sheet U_LDO/VOUT
+VDD_HS: port +VDD_HS_D, sheet U_LDO/VOUT

### Notes on the sheet
- R2=20kOhm
  LDO_2.6V: R1=45kOhm
  LDO_1.8V: R1=25kOhm
  LDO_1.5V: R1=17.5kOhm
  LDO_1.0V: R1=5kOhm
  LDO_0.8V: R1=0Ohm

## Sheet LDO.SchDoc
size A; SheetNumber: 6; SheetTotal: 8
Used 6 times, as channels U_Power/U_LDO, U_Power/U_LDO, U_Power/U_LDO, U_Power/U_LDO, U_Power/U_LDO, U_Power/U_LDO. Parts and nets are listed once, with the designators drawn on the sheet.
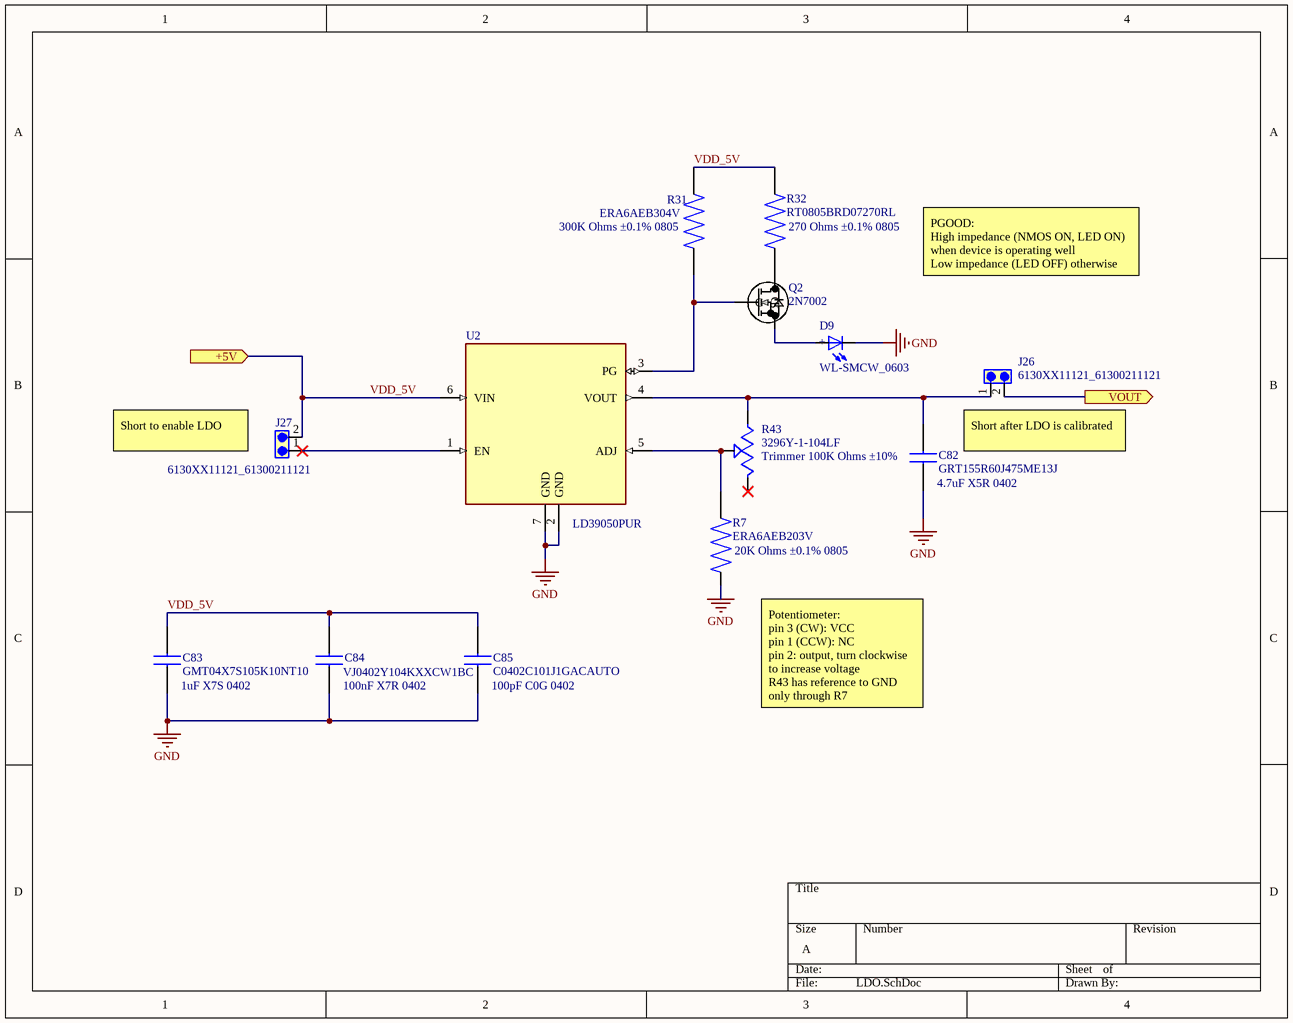
[diagram p5: LDO.SchDoc]

### Parts
C82  GRT155R60J475ME13J  [CAPC1005X60N]
C83  GMT04X7S105K10NT10  [CAPC1005X55N]
C84  VJ0402Y104KXXCW1BC  [CAPC1005X55N]
C85  C0402C101J1GACAUTO  [CAPC1005X55N]
D9  WL-SMCW_0603  [WL-SMCW_0603]
J26  6130XX11121_61300211121  [61300211121]
J27  6130XX11121_61300211121  [61300211121]
Q2  2N7002  [SOT-23TO-236_318-08_ONS]
R7  ERA6AEB203V  [RES_ERA6AEB203V]
R31  ERA6AEB304V  [RES_ERA6AEB304V]
R32  RT0805BRD07270RL  [RESC2012X60N]
R43  3296Y-1-104LF  [TRIM_3296Y-1-104LF]
U2  LD39050PUR  [SON95P300X300X100-7N]

### Ports
+5V (in), VOUT (out)

### Nets
GND: C82.1 C83.1 C84.1 C85.1 D9.1(NEG) R7.1 U2.2(GND) U2.7(GND)
VDD_5V: C83.2 C84.2 C85.2 J27.2 R31.1 R32.2 U2.6(VIN) ; port +5V
VOUT: J26.2 ; port VOUT
NetC82_2: C82.2 J26.1 R43.3(CW) U2.4(VOUT)
NetD9_2: D9.2(POS) Q2.2(S)
NetJ27_1: J27.1 U2.1(EN)
NetQ2_1: Q2.1(G) R31.2 U2.3(PG)
NetQ2_3: Q2.3(D) R32.1
NetR7_2: R7.2 R43.2(WIPER) U2.5(ADJ)

Not connected (* = marked no-connect by the designer): R43 1(CCW)*

### Channels
U_Power/U_LDO: designators C82=C_U682 C83=C_U683 C84=C_U684 C85=C_U685 D9=D_U69 J26=J_U626 J27=J_U627 Q2=Q_U62 R7=R_U67 R31=R_U631 R32=R_U632 R43=R_U643 U2=U_U62; ports +5V=VDD_5V VOUT=+3.3V
U_Power/U_LDO: designators C82=C_U582 C83=C_U583 C84=C_U584 C85=C_U585 D9=D_U59 J26=J_U526 J27=J_U527 Q2=Q_U52 R7=R_U57 R31=R_U531 R32=R_U532 R43=R_U543 U2=U_U52; ports +5V=VDD_5V VOUT=+1.5V
U_Power/U_LDO: designators C82=C_U482 C83=C_U483 C84=C_U484 C85=C_U485 D9=D_U49 J26=J_U426 J27=J_U427 Q2=Q_U42 R7=R_U47 R31=R_U431 R32=R_U432 R43=R_U443 U2=U_U42; ports +5V=VDD_5V VOUT=+VDD_ERS
U_Power/U_LDO: designators C82=C_U382 C83=C_U383 C84=C_U384 C85=C_U385 D9=D_U39 J26=J_U326 J27=J_U327 Q2=Q_U32 R7=R_U37 R31=R_U331 R32=R_U332 R43=R_U343 U2=U_U32; ports +5V=VDD_5V VOUT=+1.8V
U_Power/U_LDO: designators C82=C_U282 C83=C_U283 C84=C_U284 C85=C_U285 D9=D_U29 J26=J_U226 J27=J_U227 Q2=Q_U22 R7=R_U27 R31=R_U231 R32=R_U232 R43=R_U243 U2=U_U22; ports +5V=VDD_5V VOUT=+2.6V
U_Power/U_LDO: designators C82=C_U182 C83=C_U183 C84=C_U184 C85=C_U185 D9=D_U19 J26=J_U126 J27=J_U127 Q2=Q_U12 R7=R_U17 R31=R_U131 R32=R_U132 R43=R_U143 U2=U_U12; ports +5V=VDD_5V VOUT=+VDD_HS

### Notes on the sheet
- (near R31) 300K Ohms ±0.1% 0805
- (near R32) 270 Ohms ±0.1% 0805
- PGOOD:
  High impedance (NMOS ON, LED ON) when device is operating well
  Low impedance (LED OFF) otherwise
- (near J27) Short to enable LDO
- (near R43) Trimmer 100K Ohms ±10%
- (near C82) 4.7uF X5R 0402
- Short after LDO is calibrated
- (near R7) 20K Ohms ±0.1% 0805
- (near C83) 1uF X7S 0402
- (near C84) 100nF X7R 0402
- (near C85) 100pF C0G 0402
- (near R7) Potentiometer:
  pin 3 (CW): VCC
  pin 1 (CCW): NC
  pin 2: output, turn clockwise to increase voltage
  R43 has reference to GND only through R7
- (in symbol WL-SMCW_0603) +

### Library data of the parts
C82 = GRT155R60J475ME13J: SMD capacitor X5R(EIA) with capacitance 4.7uF Tol.20%. Rated voltage 6.3Vdc 85C; MF: Murata; SnapEDA_Link: https://www.snapeda.com/parts/GRT155R60J475ME13J/Murata/view-part/?ref=snap; Package: 1005 Taiyo Yuden; Value: *; MP: GRT155R60J475ME13J; Check_prices: https://www.snapeda.com/parts/GRT155R60J475ME13J/Murata/view-part/?ref=eda
C83 = GMT04X7S105K10NT10: 1 µF ±10% 10V Ceramic Capacitor X7S 0402 (1005 Metric); MF: Vishay Vitramon; MP: VJ0402Y104KXXCW1BC; SnapEDA_Link: https://www.snapeda.com/parts/VJ0402Y104KXXCW1BC/Vishay/view-part/?ref=snap; Package: 0402-2 VISHAY; Value: *; Check_prices: https://www.snapeda.com/parts/VJ0402Y104KXXCW1BC/Vishay/view-part/?ref=eda
C84 = VJ0402Y104KXXCW1BC: 0.1 ÂµF Â±10% 25V Ceramic Capacitor X7R 0402 (1005 Metric); MF: Vishay Vitramon; SnapEDA_Link: https://www.snapeda.com/parts/VJ0402Y104KXXCW1BC/Vishay/view-part/?ref=snap; Package: 0402-2 VISHAY; Value: *; MP: VJ0402Y104KXXCW1BC; Check_prices: https://www.snapeda.com/parts/VJ0402Y104KXXCW1BC/Vishay/view-part/?ref=eda
C85 = C0402C101J1GACAUTO: 100 pF ±5% 100V Ceramic Capacitor C0G, NP0 0402 (1005 Metric); MF: {'manufacturer': u'KEMET'}; Package: None; Price: None; Value: *; MP: C0402C101J1GACAUTO; Availability: Unavailable
D9 = WL-SMCW_0603: 0603, Green Typ.(@20mA): 520nm, 430mcd, 3.2V, 140Â° InGaN; MF: Wurth Electronics; MP: 150060GS75000; SnapEDA_Link: https://www.snapeda.com/parts/150060GS75000/Wurth+Electronics/view-part/?ref=snap; Package: 0603 WÃ¼rth Elektronik; Value: *; Check_prices: https://www.snapeda.com/parts/150060GS75000/Wurth+Electronics/view-part/?ref=eda
J26 J27 = 6130XX11121_61300211121: as J3 on sheet Connectors; Package: None; Price: None; Value: *; MP: 61300211121; Availability: Unavailable; ComponentLink1Description: Digikey link; ComponentLink1URL: https://www.digikey.com/en/products/detail/w%C3%BCrth-elektronik/61300211121/4846823
Q2 = 2N7002: N-Channel 60 V 115mA (Ta) 200mW (Ta) Surface Mount SOT-23-3; Manufacturer_Name: onsemi; Copyright: Copyright (C) 2026 Ultra Librarian. All rights reserved.; Manufacturer_Part_Number: 2N7002
R7 = ERA6AEB203V: RES SMD 20K OHM 0.1% 1/8W 0805; Availability: Unavailable; Price: None; Package: None; Value: *; MP: ERA6AEB203V; ComponentLink1Description: Digikey link; ComponentLink1URL: https://www.digikey.com/en/products/detail/panasonic-industry/ERA-6AEB203V/1465780?_gl=1*16ggu6x*_up*MQ..*_gs*MQ..&gclid=CjwKCAjw6f3RBhApEiwAMaCqWWAys7UYOKri6355z56lT8wD9j8kH64REZKYwhM8W5opH-dHb2-LKxoC2UMQAvD_BwE&gclsrc=aw.ds&gbraid=0AAAAADrbLliUt3fRxN84rEH66mf2IHcf7
R31 = ERA6AEB304V: RES SMD 300K OHM 0.1% 1/8W 0805; Availability: Unavailable; MP: ERA6AEB304V; Value: *; Price: None; Package: None; ComponentLink1Description: Digikey link; ComponentLink1URL: https://www.digikey.com/en/products/detail/panasonic-industry/ERA-6AEB304V/1465808
R32 = RT0805BRD07270RL: 270 Ohms ±0.1% 0.125W, 1/8W Chip Resistor 0805 (2012 Metric) Thin Film; Package: None; Price: None; Value: *; MP: RT0805BRD07270RL; Availability: Unavailable
R43 = 3296Y-1-104LF: 100 kOhms 0.5W, 1/2W PC Pins Through Hole Trimmer Potentiometer Cermet 25.0 Turn Top Adjustment; MP: 3296Y-1-104LF; Availability: Unavailable; Value: *; Package: None; Price: None
U2 = LD39050PUR: Linear Voltage Regulator IC 1 Output 500mA 6-DFN _3x3_; MF: STMicroelectronics; Package: DFN-6 STMicroelectronics; SnapEDA_Link: https://www.snapeda.com/parts/LD39050PUR/STMicroelectronics/view-part/493713/?ref=snap; MP: LD39050PUR; Value: *; Digi-Key_Part_Number: 497-8717-1-ND; Digi-Key_Purchase_URL: https://www.digikey.com/product-detail/en/stmicroelectronics/LD39050PUR/497-8717-1-ND/2039902?utm_source=snapeda&utm_medium=aggregator&utm_campaign=symbol; ComponentLink1Description: Digikey link; ComponentLink1URL: https://www.digikey.com/en/products/detail/LD39050PUR/497-8717-1-ND/2039902

## Sheet Chip.SchDoc
size D; SheetNumber: 7; SheetTotal: 8
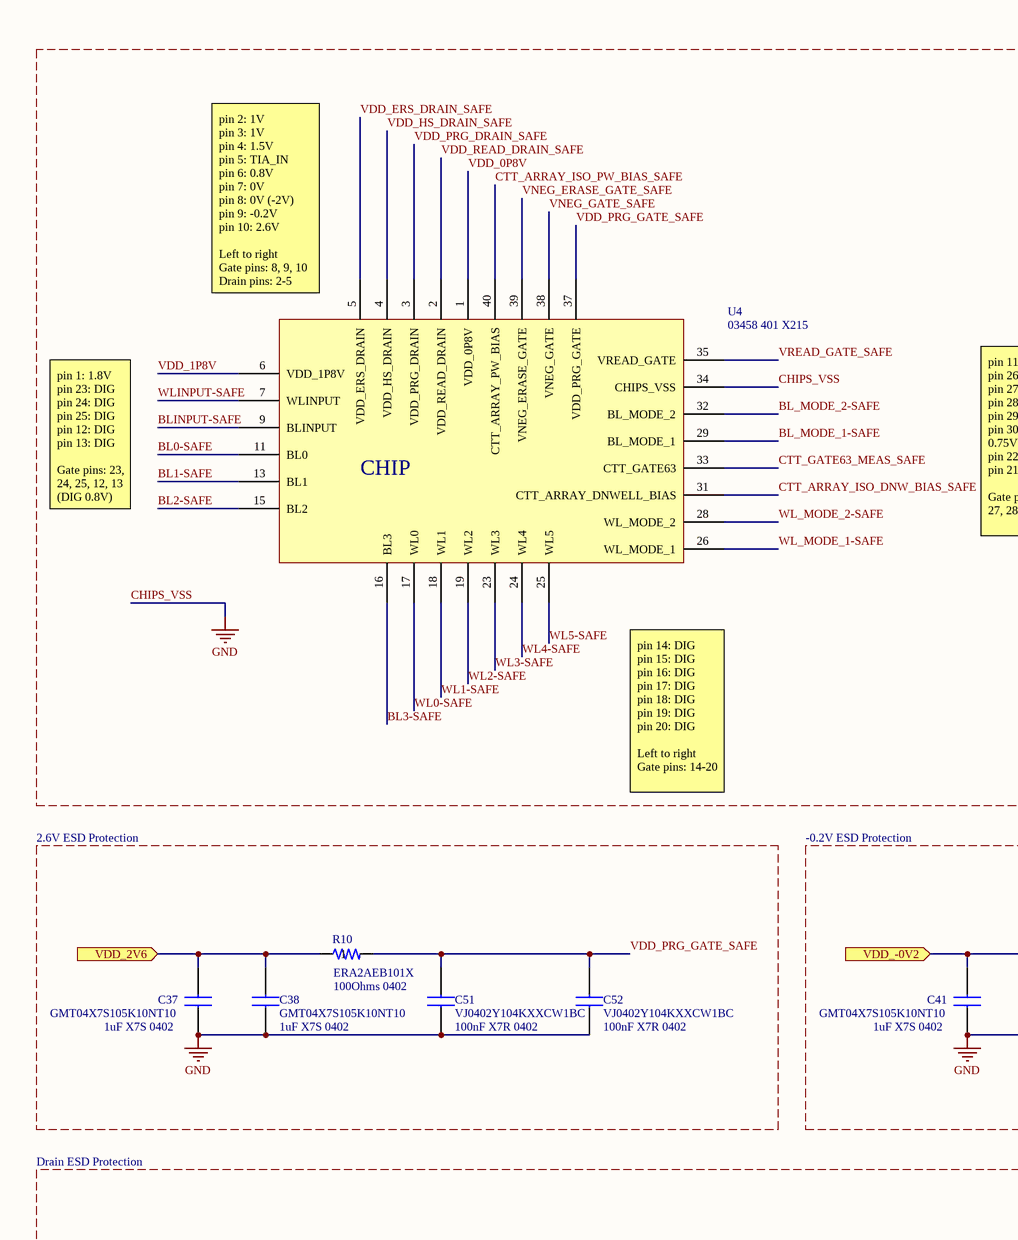
[diagram p6: Chip.SchDoc, top left]
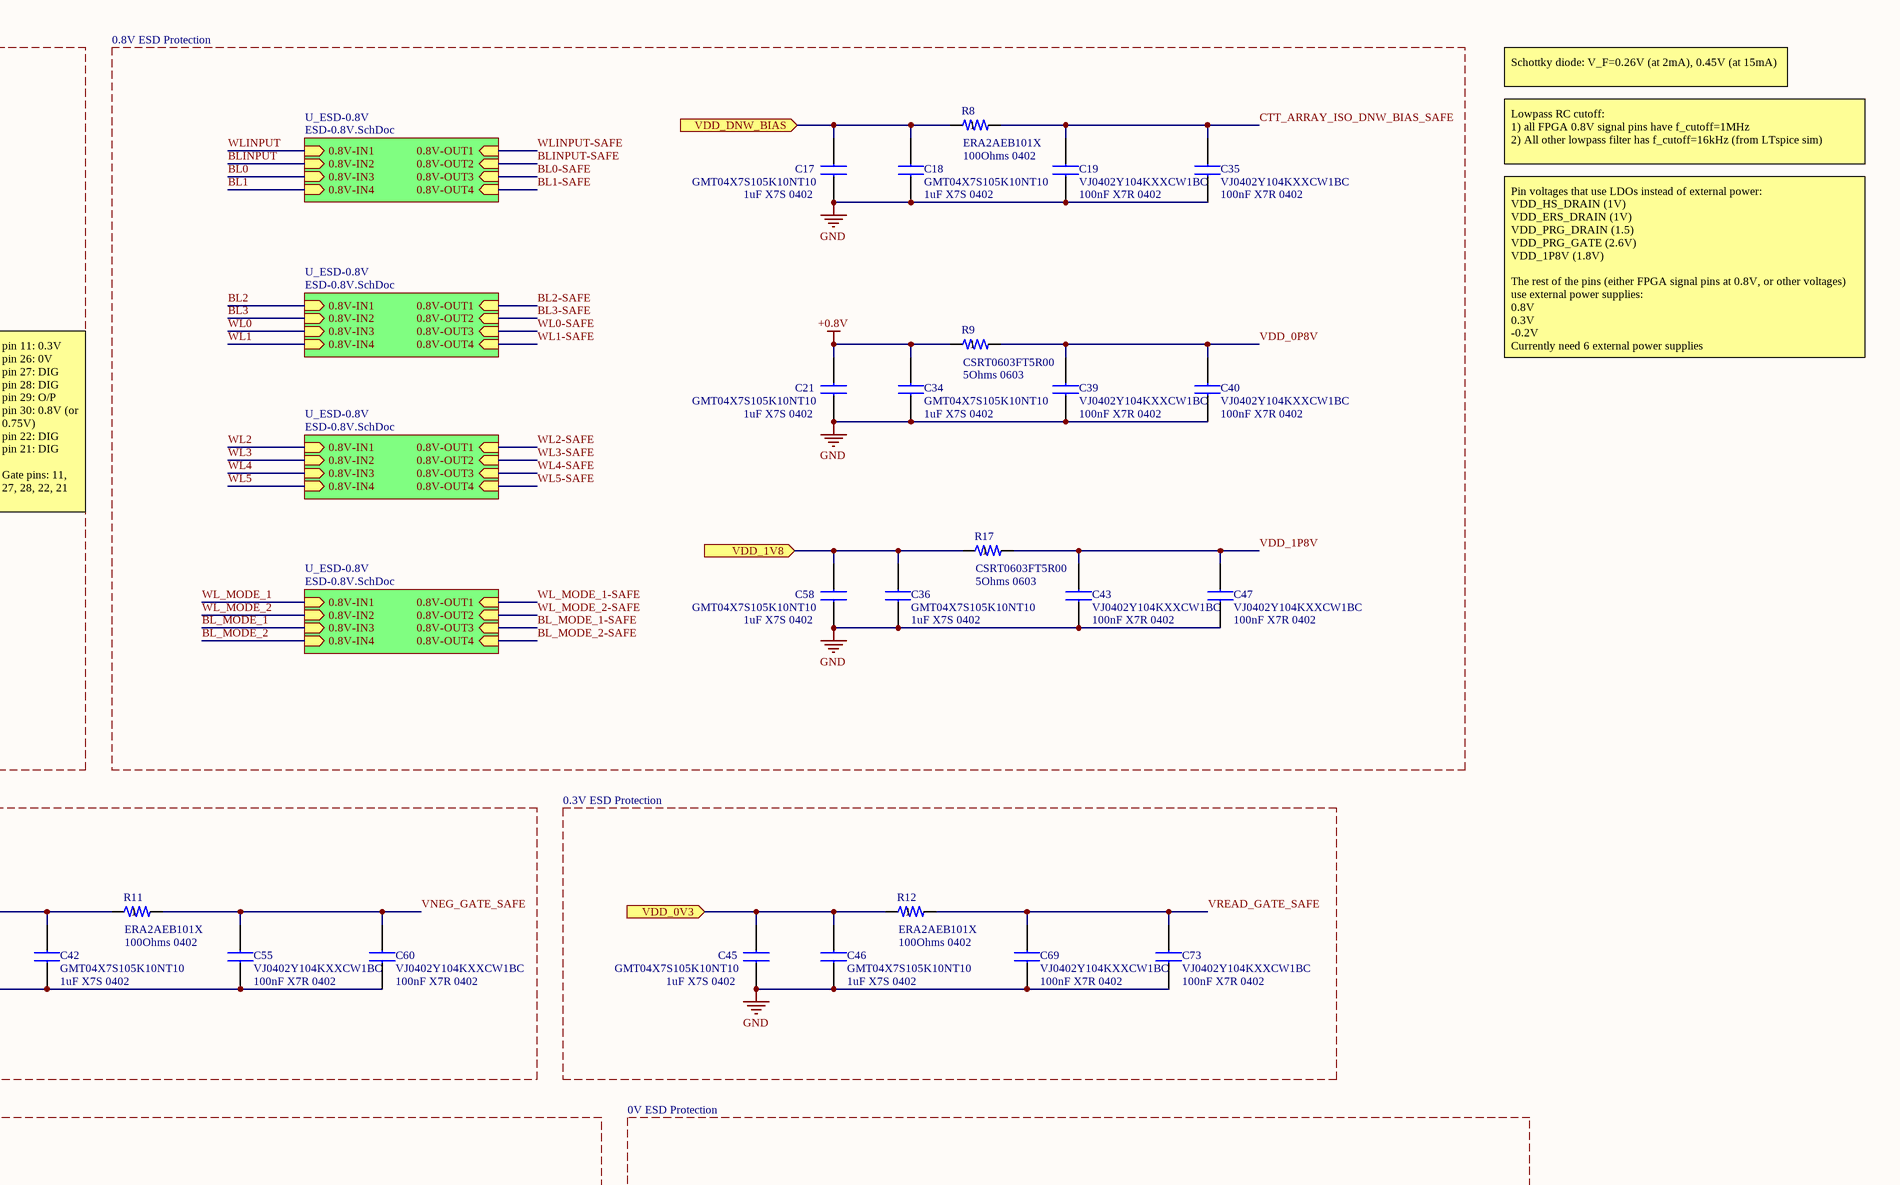
[diagram p7: Chip.SchDoc, top right]
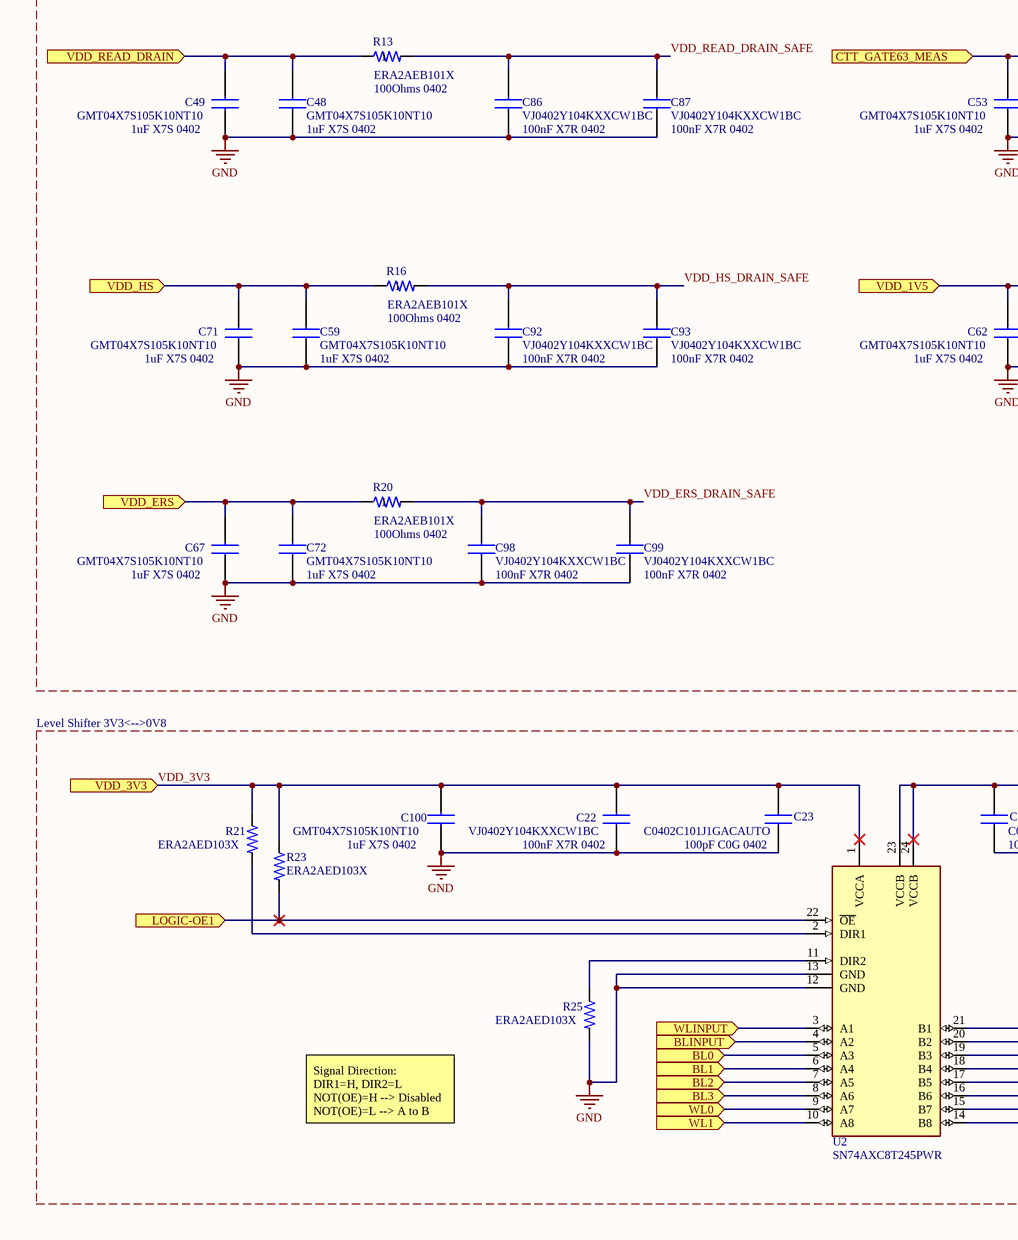
[diagram p8: Chip.SchDoc, bottom left]
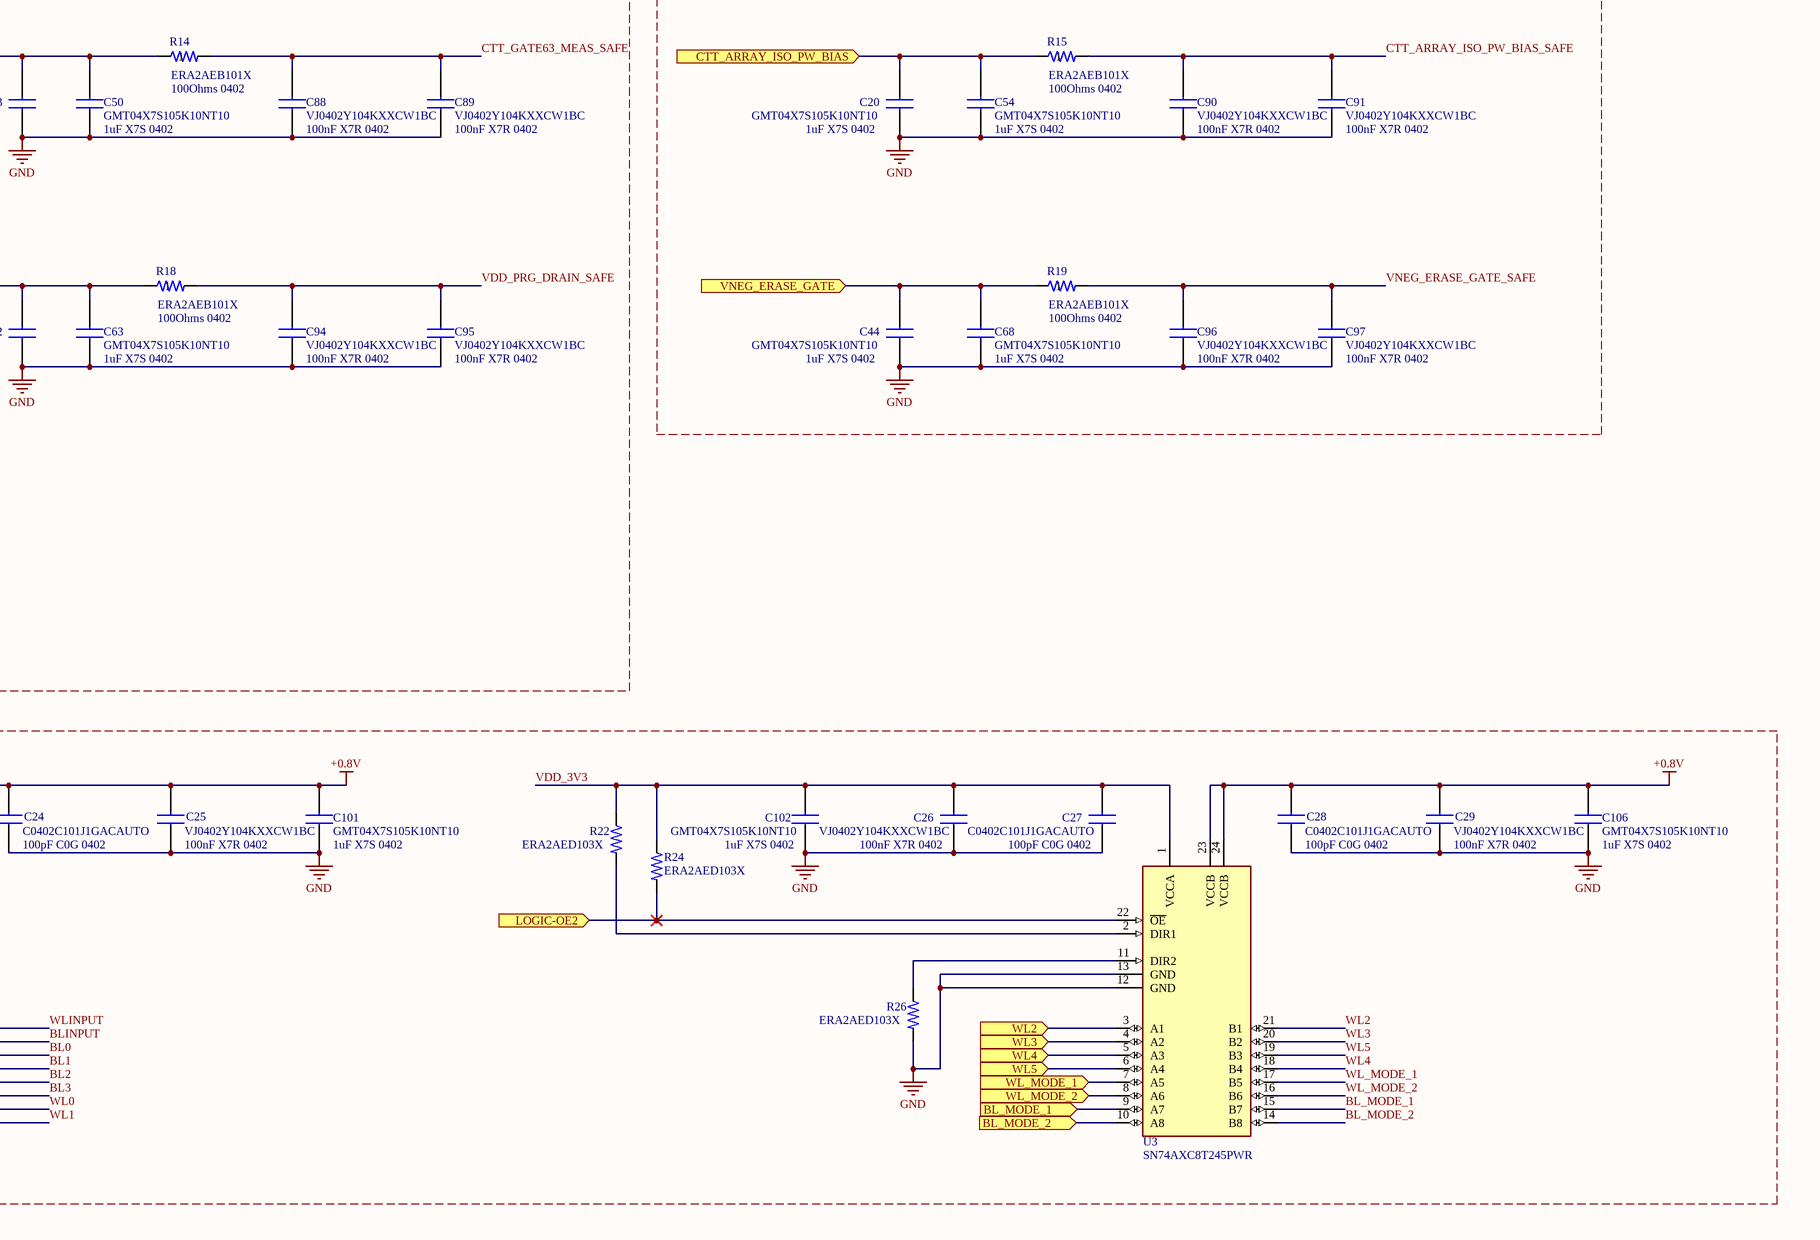
[diagram p9: Chip.SchDoc, bottom right]

### Parts
C17  GMT04X7S105K10NT10  [CAPC1005X55N]
C18  GMT04X7S105K10NT10  [CAPC1005X55N]
C19  VJ0402Y104KXXCW1BC  [CAPC1005X55N]
C20  GMT04X7S105K10NT10  [CAPC1005X55N]
C21  GMT04X7S105K10NT10  [CAPC1005X55N]
C22  VJ0402Y104KXXCW1BC  [CAPC1005X55N]
C23  C0402C101J1GACAUTO  [CAPC1005X55N]
C24  C0402C101J1GACAUTO  [CAPC1005X55N]
C25  VJ0402Y104KXXCW1BC  [CAPC1005X55N]
C26  VJ0402Y104KXXCW1BC  [CAPC1005X55N]
C27  C0402C101J1GACAUTO  [CAPC1005X55N]
C28  C0402C101J1GACAUTO  [CAPC1005X55N]
C29  VJ0402Y104KXXCW1BC  [CAPC1005X55N]
C34  GMT04X7S105K10NT10  [CAPC1005X55N]
C35  VJ0402Y104KXXCW1BC  [CAPC1005X55N]
C36  GMT04X7S105K10NT10  [CAPC1005X55N]
C37  GMT04X7S105K10NT10  [CAPC1005X55N]
C38  GMT04X7S105K10NT10  [CAPC1005X55N]
C39  VJ0402Y104KXXCW1BC  [CAPC1005X55N]
C40  VJ0402Y104KXXCW1BC  [CAPC1005X55N]
C41  GMT04X7S105K10NT10  [CAPC1005X55N]
C42  GMT04X7S105K10NT10  [CAPC1005X55N]
C43  VJ0402Y104KXXCW1BC  [CAPC1005X55N]
C44  GMT04X7S105K10NT10  [CAPC1005X55N]
C45  GMT04X7S105K10NT10  [CAPC1005X55N]
C46  GMT04X7S105K10NT10  [CAPC1005X55N]
C47  VJ0402Y104KXXCW1BC  [CAPC1005X55N]
C48  GMT04X7S105K10NT10  [CAPC1005X55N]
C49  GMT04X7S105K10NT10  [CAPC1005X55N]
C50  GMT04X7S105K10NT10  [CAPC1005X55N]
C51  VJ0402Y104KXXCW1BC  [CAPC1005X55N]
C52  VJ0402Y104KXXCW1BC  [CAPC1005X55N]
C53  GMT04X7S105K10NT10  [CAPC1005X55N]
C54  GMT04X7S105K10NT10  [CAPC1005X55N]
C55  VJ0402Y104KXXCW1BC  [CAPC1005X55N]
C58  GMT04X7S105K10NT10  [CAPC1005X55N]
C59  GMT04X7S105K10NT10  [CAPC1005X55N]
C60  VJ0402Y104KXXCW1BC  [CAPC1005X55N]
C62  GMT04X7S105K10NT10  [CAPC1005X55N]
C63  GMT04X7S105K10NT10  [CAPC1005X55N]
C67  GMT04X7S105K10NT10  [CAPC1005X55N]
C68  GMT04X7S105K10NT10  [CAPC1005X55N]
C69  VJ0402Y104KXXCW1BC  [CAPC1005X55N]
C71  GMT04X7S105K10NT10  [CAPC1005X55N]
C72  GMT04X7S105K10NT10  [CAPC1005X55N]
C73  VJ0402Y104KXXCW1BC  [CAPC1005X55N]
C86  VJ0402Y104KXXCW1BC  [CAPC1005X55N]
C87  VJ0402Y104KXXCW1BC  [CAPC1005X55N]
C88  VJ0402Y104KXXCW1BC  [CAPC1005X55N]
C89  VJ0402Y104KXXCW1BC  [CAPC1005X55N]
C90  VJ0402Y104KXXCW1BC  [CAPC1005X55N]
C91  VJ0402Y104KXXCW1BC  [CAPC1005X55N]
C92  VJ0402Y104KXXCW1BC  [CAPC1005X55N]
C93  VJ0402Y104KXXCW1BC  [CAPC1005X55N]
C94  VJ0402Y104KXXCW1BC  [CAPC1005X55N]
C95  VJ0402Y104KXXCW1BC  [CAPC1005X55N]
C96  VJ0402Y104KXXCW1BC  [CAPC1005X55N]
C97  VJ0402Y104KXXCW1BC  [CAPC1005X55N]
C98  VJ0402Y104KXXCW1BC  [CAPC1005X55N]
C99  VJ0402Y104KXXCW1BC  [CAPC1005X55N]
C100  GMT04X7S105K10NT10  [CAPC1005X55N]
C101  GMT04X7S105K10NT10  [CAPC1005X55N]
C102  GMT04X7S105K10NT10  [CAPC1005X55N]
C106  GMT04X7S105K10NT10  [CAPC1005X55N]
R8  ERA2AEB101X  [RES_ERA2AEB101X]
R9  CSRT0603FT5R00  [RES_CSRT0603_STP]
R10  ERA2AEB101X  [RES_ERA2AEB101X]
R11  ERA2AEB101X  [RES_ERA2AEB101X]
R12  ERA2AEB101X  [RES_ERA2AEB101X]
R13  ERA2AEB101X  [RES_ERA2AEB101X]
R14  ERA2AEB101X  [RES_ERA2AEB101X]
R15  ERA2AEB101X  [RES_ERA2AEB101X]
R16  ERA2AEB101X  [RES_ERA2AEB101X]
R17  CSRT0603FT5R00  [RES_CSRT0603_STP]
R18  ERA2AEB101X  [RES_ERA2AEB101X]
R19  ERA2AEB101X  [RES_ERA2AEB101X]
R20  ERA2AEB101X  [RES_ERA2AEB101X]
R21  ERA2AED103X  [RES_ERA2A_PAN]
R22  ERA2AED103X  [RES_ERA2A_PAN]
R23  ERA2AED103X  [RES_ERA2A_PAN]
R24  ERA2AED103X  [RES_ERA2A_PAN]
R25  ERA2AED103X  [RES_ERA2A_PAN]
R26  ERA2AED103X  [RES_ERA2A_PAN]
U2  SN74AXC8T245PWR  [SOP65P640X120-24N]
U3  SN74AXC8T245PWR  [SOP65P640X120-24N]
U4  03458 401 X215  [03458 401 X215]

### Sub-sheets
U_ESD-0.8V = ESD-0.8V.SchDoc: 0.8V-IN1 (in), 0.8V-IN2 (in), 0.8V-IN3 (in), 0.8V-IN4 (in), 0.8V-OUT1 (in), 0.8V-OUT2 (in), 0.8V-OUT3 (in), 0.8V-OUT4 (in)
U_ESD-0.8V = ESD-0.8V.SchDoc: 0.8V-IN1 (in), 0.8V-IN2 (in), 0.8V-IN3 (in), 0.8V-IN4 (in), 0.8V-OUT1 (in), 0.8V-OUT2 (in), 0.8V-OUT3 (in), 0.8V-OUT4 (in)
U_ESD-0.8V = ESD-0.8V.SchDoc: 0.8V-IN1 (in), 0.8V-IN2 (in), 0.8V-IN3 (in), 0.8V-IN4 (in), 0.8V-OUT1 (in), 0.8V-OUT2 (in), 0.8V-OUT3 (in), 0.8V-OUT4 (in)
U_ESD-0.8V = ESD-0.8V.SchDoc: 0.8V-IN1 (in), 0.8V-IN2 (in), 0.8V-IN3 (in), 0.8V-IN4 (in), 0.8V-OUT1 (in), 0.8V-OUT2 (in), 0.8V-OUT3 (in), 0.8V-OUT4 (in)

### Ports
BL0 (in), BL1 (in), BL2 (in), BL3 (in), BL_MODE_1 (in), BL_MODE_2 (in), BLINPUT (in), CTT_ARRAY_ISO_PW_BIAS (in), CTT_GATE63_MEAS (in), LOGIC-OE1 (in), LOGIC-OE2 (in), VDD_0V3 (in), VDD_1V5 (in), VDD_1V8 (in), VDD_2V6 (in), VDD_3V3 (in), VDD_-0V2 (in), VDD_DNW_BIAS (in), VDD_ERS (in), VDD_HS (in), VDD_READ_DRAIN (in), VNEG_ERASE_GATE (in), WL0 (in), WL1 (in), WL2 (in), WL3 (in), WL4 (in), WL5 (in), WL_MODE_1 (in), WL_MODE_2 (in), WLINPUT (in)

### Nets
+0.3V: C45.2 C46.2 R12.1 ; port VDD_0V3
+0.8V: C21.2 C24.2 C25.2 C28.2 C29.2 C34.2 C101.2 C106.2 R9.1 U2.23(VCCB) U2.24(VCCB) U3.23(VCCB) U3.24(VCCB)
-0.2V: C41.2 C42.2 R11.1 ; port VDD_-0V2
CHIPS_VSS: C17.1 C18.1 C19.1 C20.1 C21.1 C22.1 C23.1 C24.1 C25.1 C26.1 C27.1 C28.1 C29.1 C34.1 C35.1 C36.1 C37.1 C38.1 C39.1 C40.1 C41.1 C42.1 C43.1 C44.1 C45.1 C46.1 C47.1 C48.1 C49.1 C50.1 C51.1 C52.1 C53.1 C54.1 C55.1 C58.1 C59.1 C60.1 C62.1 C63.1 C67.1 C68.1 C69.1 C71.1 C72.1 C73.1 C86.1 C87.1 C88.1 C89.1 C90.1 C91.1 C92.1 C93.1 C94.1 C95.1 C96.1 C97.1 C98.1 C99.1 C100.1 C101.1 C102.1 C106.1 R25.2 R26.2 U2.12(GND) U2.13(GND) U3.12(GND) U3.13(GND) U4.34(CHIPS_VSS)  [also labelled GND]
+1.5V: C62.2 C63.2 R18.1 ; port VDD_1V5
+1.8V: C36.2 C58.2 R17.1 ; port VDD_1V8
+2.6V: C37.2 C38.2 R10.1 ; port VDD_2V6
+VDD_ERS: C67.2 C72.2 R20.1 ; port VDD_ERS
+VDD_HS: C59.2 C71.2 R16.1 ; port VDD_HS
ANALOG_OUT: C48.2 C49.2 R13.1 ; port VDD_READ_DRAIN
BL0: U2.19(B3) ; sheet U_ESD-0.8V/0.8V-IN3
BL0-SAFE: U4.11(BL0) ; sheet U_ESD-0.8V/0.8V-OUT3
BL1: U2.18(B4) ; sheet U_ESD-0.8V/0.8V-IN4
BL1-SAFE: U4.13(BL1) ; sheet U_ESD-0.8V/0.8V-OUT4
BL2: U2.17(B5) ; sheet U_ESD-0.8V/0.8V-IN1
BL2-SAFE: U4.15(BL2) ; sheet U_ESD-0.8V/0.8V-OUT1
BL3: U2.16(B6) ; sheet U_ESD-0.8V/0.8V-IN2
BL3-SAFE: U4.16(BL3) ; sheet U_ESD-0.8V/0.8V-OUT2
BL_MODE_1: U3.15(B7) ; sheet U_ESD-0.8V/0.8V-IN3
BL_MODE_1-SAFE: U4.29(BL_MODE_1) ; sheet U_ESD-0.8V/0.8V-OUT3
BL_MODE_2: U3.14(B8) ; sheet U_ESD-0.8V/0.8V-IN4
BL_MODE_2-SAFE: U4.32(BL_MODE_2) ; sheet U_ESD-0.8V/0.8V-OUT4
BLINPUT: U2.20(B2) ; sheet U_ESD-0.8V/0.8V-IN2
BLINPUT-SAFE: U4.9(BLINPUT) ; sheet U_ESD-0.8V/0.8V-OUT2
CTT_ARRAY_ISO_DNW_BIAS_SAFE: C19.2 C35.2 R8.2 U4.31(CTT_ARRAY_DNWELL_BIAS)
CTT_ARRAY_ISO_PW_BIAS_SAFE: C90.2 C91.2 R15.2 U4.40(CTT_ARRAY_PW_BIAS)
CTT_GATE63_MEAS_SAFE: C88.2 C89.2 R14.2 U4.33(CTT_GATE63)
VDD_0P8V: C39.2 C40.2 R9.2 U4.1(VDD_0P8V)
VDD_1P8V: C43.2 C47.2 R17.2 U4.6(VDD_1P8V)
VDD_3V3: C22.2 C23.2 C26.2 C27.2 C100.2 C102.2 R21.1 R22.1 R23.1 R24.1 U2.1(VCCA) U3.1(VCCA) ; port VDD_3V3  [project net +3.3V]
VDD_DNW_B: C17.2 C18.2 R8.1 ; port VDD_DNW_BIAS
VDD_ERS_DRAIN_SAFE: C98.2 C99.2 R20.2 U4.5(VDD_ERS_DRAIN)
VDD_HS_DRAIN_SAFE: C92.2 C93.2 R16.2 U4.4(VDD_HS_DRAIN)
VDD_PRG_DRAIN_SAFE: C94.2 C95.2 R18.2 U4.3(VDD_PRG_DRAIN)
VDD_PRG_GATE_SAFE: C51.2 C52.2 R10.2 U4.37(VDD_PRG_GATE)
VDD_READ_DRAIN_SAFE: C86.2 C87.2 R13.2 U4.2(VDD_READ_DRAIN)
VNEG_ERASE_GATE_SAFE: C96.2 C97.2 R19.2 U4.39(VNEG_ERASE_GATE)
VNEG_GATE_SAFE: C55.2 C60.2 R11.2 U4.38(VNEG_GATE)
VREAD_GATE_SAFE: C69.2 C73.2 R12.2 U4.35(VREAD_GATE)
WL0: U2.15(B7) ; sheet U_ESD-0.8V/0.8V-IN3
WL0-SAFE: U4.17(WL0) ; sheet U_ESD-0.8V/0.8V-OUT3
WL1: U2.14(B8) ; sheet U_ESD-0.8V/0.8V-IN4
WL1-SAFE: U4.18(WL1) ; sheet U_ESD-0.8V/0.8V-OUT4
WL2: U3.21(B1) ; sheet U_ESD-0.8V/0.8V-IN1
WL2-SAFE: U4.19(WL2) ; sheet U_ESD-0.8V/0.8V-OUT1
WL3: U3.20(B2) ; sheet U_ESD-0.8V/0.8V-IN2
WL3-SAFE: U4.23(WL3) ; sheet U_ESD-0.8V/0.8V-OUT2
WL4: U3.18(B4) ; sheet U_ESD-0.8V/0.8V-IN3
WL4-SAFE: U4.24(WL4) ; sheet U_ESD-0.8V/0.8V-OUT3
WL5: U3.19(B3) ; sheet U_ESD-0.8V/0.8V-IN4
WL5-SAFE: U4.25(WL5) ; sheet U_ESD-0.8V/0.8V-OUT4
WL_MODE_1: U3.17(B5) ; sheet U_ESD-0.8V/0.8V-IN1
WL_MODE_1-SAFE: U4.26(WL_MODE_1) ; sheet U_ESD-0.8V/0.8V-OUT1
WL_MODE_2: U3.16(B6) ; sheet U_ESD-0.8V/0.8V-IN2
WL_MODE_2-SAFE: U4.28(WL_MODE_2) ; sheet U_ESD-0.8V/0.8V-OUT2
WLINPUT: U2.21(B1) ; sheet U_ESD-0.8V/0.8V-IN1
WLINPUT-SAFE: U4.7(WLINPUT) ; sheet U_ESD-0.8V/0.8V-OUT1
NetC20_2: C20.2 C54.2 R15.1 ; port CTT_ARRAY_ISO_PW_BIAS
NetC44_2: C44.2 C68.2 R19.1 ; port VNEG_ERASE_GATE
NetC50_2: C50.2 C53.2 R14.1 ; port CTT_GATE63_MEAS
NetJ6_2: U2.3(A1) ; port WLINPUT
NetJ6_4: U2.4(A2) ; port BLINPUT
NetJ6_6: U2.5(A3) ; port BL0
NetJ6_8: U2.6(A4) ; port BL1
NetJ7_2: U2.7(A5) ; port BL2
NetJ7_4: U2.8(A6) ; port BL3
NetJ7_6: U2.9(A7) ; port WL0
NetJ7_8: U2.10(A8) ; port WL1
NetJ8_1: U3.10(A8) ; port BL_MODE_2
NetJ8_3: U3.9(A7) ; port BL_MODE_1
NetJ8_5: U3.8(A6) ; port WL_MODE_2
NetJ8_7: U3.7(A5) ; port WL_MODE_1
NetJ9_1: U3.6(A4) ; port WL5
NetJ9_3: U3.5(A3) ; port WL4
NetJ9_5: U3.4(A2) ; port WL3
NetJ9_7: U3.3(A1) ; port WL2
NetJ30_1: R23.2 U2.22(~{OE}) ; port LOGIC-OE1
NetJ31_1: R24.2 U3.22(~{OE}) ; port LOGIC-OE2
NetR21_2: R21.2 U2.2(DIR1)
NetR22_2: R22.2 U3.2(DIR1)
NetR25_1: R25.1 U2.11(DIR2)
NetR26_1: R26.1 U3.11(DIR2)

### Notes on the sheet
- 0.8V ESD Protection
- Schottky diode: V_F=0.26V (at 2mA), 0.45V (at 15mA)
- 100Ohms 0402
- Lowpass RC cutoff:
  1) all FPGA 0.8V signal pins have f_cutoff=1MHz
  2) All other lowpass filter has f_cutoff=16kHz (from LTspice sim)
- (near C17) 1uF X7S 0402
- (near C18) 1uF X7S 0402
- (near C19) 100nF X7R 0402
- (near C35) 100nF X7R 0402
- (near U4) pin 2: 1V
  pin 3: 1V
  pin 4: 1.5V
  pin 5: TIA_IN
  pin 6: 0.8V
  pin 7: 0V
  pin 8: 0V (-2V)
  pin 9: -0.2V
  pin 10: 2.6V
  Left to right
  Gate pins: 8, 9, 10
  Drain pins: 2-5
- Pin voltages that use LDOs instead of external power:
  VDD_HS_DRAIN (1V)
  VDD_ERS_DRAIN (1V)
  VDD_PRG_DRAIN (1.5)
  VDD_PRG_GATE (2.6V)
  VDD_1P8V (1.8V)
  The rest of the pins (either FPGA signal pins at 0.8V, or other voltages) use external power supplies:
  0.8V
  0.3V
  -0.2V
  Currently need 6 external power supplies
- (near C21) 1uF X7S 0402
- (near C34) 1uF X7S 0402
- (near R9) 5Ohms 0603
- (near C39) 100nF X7R 0402
- (near C40) 100nF X7R 0402
- pin 1: 1.8V
  pin 23: DIG
  pin 24: DIG
  pin 25: DIG
  pin 12: DIG
  pin 13: DIG
  Gate pins: 23, 24, 25, 12, 13 (DIG 0.8V)
- pin 11: 0.3V
  pin 26: 0V
  pin 27: DIG
  pin 28: DIG
  pin 29: O/P
  pin 30: 0.8V (or 0.75V)
  pin 22: DIG
  pin 21: DIG
  Gate pins: 11, 27, 28, 22, 21
- (near C58) 1uF X7S 0402
- (near C36) 1uF X7S 0402
- (near R17) 5Ohms 0603
- (near C43) 100nF X7R 0402
- (near C47) 100nF X7R 0402
- pin 14: DIG
  pin 15: DIG
  pin 16: DIG
  pin 17: DIG
  pin 18: DIG
  pin 19: DIG
  pin 20: DIG
  Left to right
  Gate pins: 14-20
- 2.6V ESD Protection
- -0.2V ESD Protection
- 0.3V ESD Protection
- (near R11) 100Ohms 0402
- (near R12) 100Ohms 0402
- (near C37) 1uF X7S 0402
- (near C38) 1uF X7S 0402
- (near C51) 100nF X7R 0402
- (near C52) 100nF X7R 0402
- (near C41) 1uF X7S 0402
- (near C42) 1uF X7S 0402
- (near C55) 100nF X7R 0402
- (near C60) 100nF X7R 0402
- (near C45) 1uF X7S 0402
- (near C46) 1uF X7S 0402
- (near C69) 100nF X7R 0402
- (near C73) 100nF X7R 0402
- Drain ESD Protection
- 0V ESD Protection
- (near R13) 100Ohms 0402
- (near R14) 100Ohms 0402
- (near R15) 100Ohms 0402
- (near C49) 1uF X7S 0402
- (near C48) 1uF X7S 0402
- (near C86) 100nF X7R 0402
- (near C87) 100nF X7R 0402
- (near C53) 1uF X7S 0402
- (near C50) 1uF X7S 0402
- (near C88) 100nF X7R 0402
- (near C89) 100nF X7R 0402
- (near C20) 1uF X7S 0402
- (near C54) 1uF X7S 0402
- (near C90) 100nF X7R 0402
- (near C91) 100nF X7R 0402
- (near R16) 100Ohms 0402
- (near R18) 100Ohms 0402
- (near R19) 100Ohms 0402
- (near C71) 1uF X7S 0402
- (near C59) 1uF X7S 0402
- (near C92) 100nF X7R 0402
- (near C93) 100nF X7R 0402
- (near C62) 1uF X7S 0402
- (near C63) 1uF X7S 0402
- (near C94) 100nF X7R 0402
- (near C95) 100nF X7R 0402
- (near C44) 1uF X7S 0402
- (near C68) 1uF X7S 0402
- (near C96) 100nF X7R 0402
- (near C97) 100nF X7R 0402
- (near C67) 1uF X7S 0402
- (near C72) 1uF X7S 0402
- (near C98) 100nF X7R 0402
- (near C99) 100nF X7R 0402
- Level Shifter 3V3<-->0V8
- (near C100) 1uF X7S 0402
- (near C22) 100nF X7R 0402
- (near C23) 100pF C0G 0402
- (near C24) 100pF C0G 0402
- (near C25) 100nF X7R 0402
- (near C101) 1uF X7S 0402
- (near C102) 1uF X7S 0402
- (near C26) 100nF X7R 0402
- (near C27) 100pF C0G 0402
- (near C28) 100pF C0G 0402
- (near C29) 100nF X7R 0402
- (near C106) 1uF X7S 0402
- Signal Direction:
  DIR1=H, DIR2=L
  NOT(OE)=H --> Disabled
  NOT(OE)=L --> A to B
- (in symbol 03458 401 X215) CHIP

### Library data of the parts
C17 C18 C20 C21 C34 C36-C38 C41 C42 C44-C46 C48-C50 C53 C54 C58 C59 C62 C63 C67 C68 C71 C72 C100-C102 C106 = GMT04X7S105K10NT10: as C83 on sheet LDO; SnapEDA_Link: https://www.snapeda.com/parts/VJ0402Y104KXXCW1BC/Vishay/view-part/?ref=snap; Package: 0402-2 VISHAY; Value: *; Check_prices: https://www.snapeda.com/parts/VJ0402Y104KXXCW1BC/Vishay/view-part/?ref=eda
C19 C22 C25 C26 C29 C35 C39 C40 C43 C47 C51 C52 C55 C60 C69 C73 C86-C99 = VJ0402Y104KXXCW1BC: as C84 on sheet LDO; SnapEDA_Link: https://www.snapeda.com/parts/VJ0402Y104KXXCW1BC/Vishay/view-part/?ref=snap; Package: 0402-2 VISHAY; Value: *; MP: VJ0402Y104KXXCW1BC; Check_prices: https://www.snapeda.com/parts/VJ0402Y104KXXCW1BC/Vishay/view-part/?ref=eda
C23 C24 C27 C28 = C0402C101J1GACAUTO: as C85 on sheet LDO; Package: None; Price: None; Value: *; MP: C0402C101J1GACAUTO; Availability: Unavailable
R8 R10-R16 R18-R20 = ERA2AEB101X: 100 Ohms ±0.1% 0.063W, 1/16W Chip Resistor 0402 (1005 Metric) Automotive AEC-Q200 Thin Film; Availability: Unavailable; Package: None; MP: ERA2AEB101X; Value: *; Price: None
R9 R17 = CSRT0603FT5R00: 5 Ohms ±1% 0.4W Chip Resistor 0603 (1608 Metric) Automotive AEC-Q200, Current Sense Thin Film; Manufacturer_Name: Stackpole International; Type: Chip Resistor - Surface Mount; Copyright: Copyright (C) 2025 Ultra Librarian. All rights reserved.; Manufacturer_Part_Number: CSRT0603FT5R00
R21-R26 = ERA2AED103X: 10 kOhms ±0.5% 0.063W, 1/16W Chip Resistor 0402 (1005 Metric) Automotive AEC-Q200 Thin Film; MF: Yageo; MP: RC0402FR-070RL; SnapEDA_Link: https://www.snapeda.com/parts/RC0402FR-070RL/Yageo/view-part/?ref=snap; Package: 0402 Yageo; Value: *; Check_prices: https://www.snapeda.com/parts/RC0402FR-070RL/Yageo/view-part/?ref=eda; ComponentLink1Description: Digikey link; ComponentLink1URL: https://www.digikey.com/en/products/detail/panasonic-industry/ERA-2AED103X/1706126
U2 U3 = SN74AXC8T245PWR: 8-bit dual-supply bus transceiver; MF: Texas Instruments; SnapEDA_Link: https://www.snapeda.com/parts/SN74AXC8T245PWR/Texas+Instruments/view-part/?ref=snap; Package: TSSOP-24 Texas Instruments; Value: *; MP: SN74AXC8T245PWR; Check_prices: https://www.snapeda.com/parts/SN74AXC8T245PWR/Texas+Instruments/view-part/?ref=eda; ComponentLink1Description: Digikey link; ComponentLink1URL: SN74AXC8T245PWR
U4 = 03458 401 X215: 40 Input/Output (I/O) and 1.02 Millimeter (mm) Pitch / Lead Chip Carrier (LCC) Socket with Castellations (live-bug load)

## Sheet ESD-0.8V.SchDoc
size A; SheetNumber: 8; SheetTotal: 8
Used 4 times, as channels U_Chip/U_ESD-0.8V, U_Chip/U_ESD-0.8V, U_Chip/U_ESD-0.8V, U_Chip/U_ESD-0.8V. Parts and nets are listed once, with the designators drawn on the sheet.
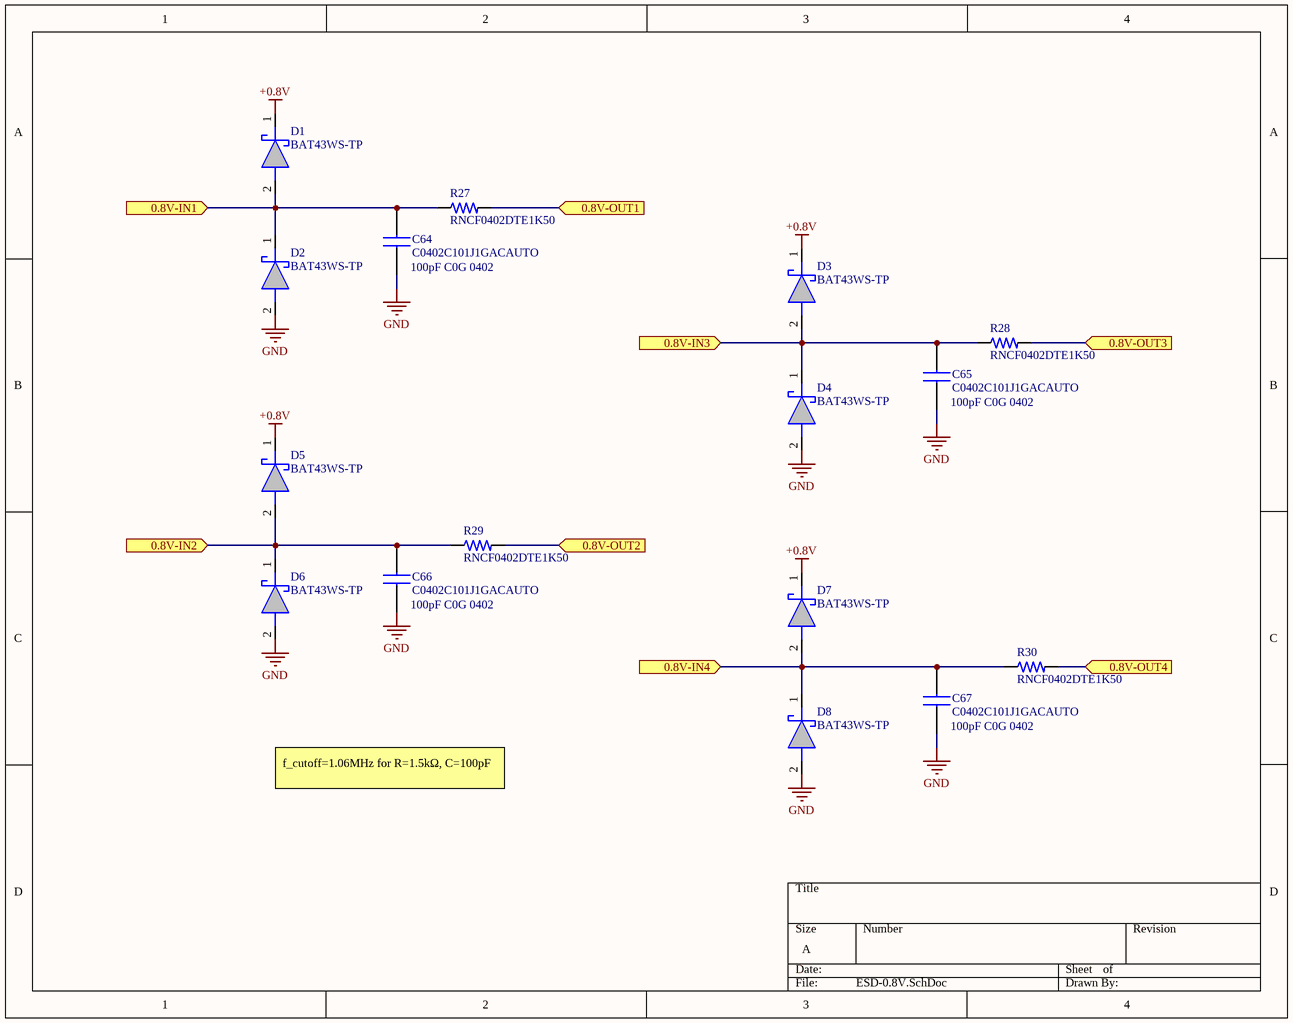
[diagram p10: ESD-0.8V.SchDoc]

### Parts
C64  C0402C101J1GACAUTO  [CAPC1005X55N]
C65  C0402C101J1GACAUTO  [CAPC1005X55N]
C66  C0402C101J1GACAUTO  [CAPC1005X55N]
C67  C0402C101J1GACAUTO  [CAPC1005X55N]
D1  BAT43WS-TP  [SOD2512X115N]
D2  BAT43WS-TP  [SOD2512X115N]
D3  BAT43WS-TP  [SOD2512X115N]
D4  BAT43WS-TP  [SOD2512X115N]
D5  BAT43WS-TP  [SOD2512X115N]
D6  BAT43WS-TP  [SOD2512X115N]
D7  BAT43WS-TP  [SOD2512X115N]
D8  BAT43WS-TP  [SOD2512X115N]
R27  RNCF0402DTE1K50  [RESC1005X35N]
R28  RNCF0402DTE1K50  [RESC1005X35N]
R29  RNCF0402DTE1K50  [RESC1005X35N]
R30  RNCF0402DTE1K50  [RESC1005X35N]

### Ports
0.8V-IN1 (in), 0.8V-IN2 (in), 0.8V-IN3 (in), 0.8V-IN4 (in), 0.8V-OUT1 (in), 0.8V-OUT2 (in), 0.8V-OUT3 (in), 0.8V-OUT4 (in)

### Nets
+0.8V: D1.1(K) D3.1(K) D5.1(K) D7.1(K)
GND: C64.1 C65.1 C66.1 C67.1 D2.2(A) D4.2(A) D6.2(A) D8.2(A)
0.8V-IN1: C64.2 D1.2(A) D2.1(K) R27.1 ; port 0.8V-IN1
0.8V-IN2: C66.2 D5.2(A) D6.1(K) R29.1 ; port 0.8V-IN2
0.8V-IN3: C65.2 D3.2(A) D4.1(K) R28.1 ; port 0.8V-IN3
0.8V-IN4: C67.2 D7.2(A) D8.1(K) R30.1 ; port 0.8V-IN4
0.8V-OUT1: R27.2 ; port 0.8V-OUT1
0.8V-OUT2: R29.2 ; port 0.8V-OUT2
0.8V-OUT3: R28.2 ; port 0.8V-OUT3
0.8V-OUT4: R30.2 ; port 0.8V-OUT4

### Channels
U_Chip/U_ESD-0.8V: designators C64=C_U464 C65=C_U465 C66=C_U466 C67=C_U467 D1=D_U41 D2=D_U42 D3=D_U43 D4=D_U44 D5=D_U45 D6=D_U46 D7=D_U47 D8=D_U48 R27=R_U427 R28=R_U428 R29=R_U429 R30=R_U430; ports 0.8V-IN1=WLINPUT 0.8V-IN2=BLINPUT 0.8V-IN3=BL0 0.8V-IN4=BL1 0.8V-OUT1=WLINPUT-SAFE 0.8V-OUT2=BLINPUT-SAFE 0.8V-OUT3=BL0-SAFE 0.8V-OUT4=BL1-SAFE
U_Chip/U_ESD-0.8V: designators C64=C_U364 C65=C_U365 C66=C_U366 C67=C_U367 D1=D_U31 D2=D_U32 D3=D_U33 D4=D_U34 D5=D_U35 D6=D_U36 D7=D_U37 D8=D_U38 R27=R_U327 R28=R_U328 R29=R_U329 R30=R_U330; ports 0.8V-IN1=WL2 0.8V-IN2=WL3 0.8V-IN3=WL4 0.8V-IN4=WL5 0.8V-OUT1=WL2-SAFE 0.8V-OUT2=WL3-SAFE 0.8V-OUT3=WL4-SAFE 0.8V-OUT4=WL5-SAFE
U_Chip/U_ESD-0.8V: designators C64=C_U264 C65=C_U265 C66=C_U266 C67=C_U267 D1=D_U21 D2=D_U22 D3=D_U23 D4=D_U24 D5=D_U25 D6=D_U26 D7=D_U27 D8=D_U28 R27=R_U227 R28=R_U228 R29=R_U229 R30=R_U230; ports 0.8V-IN1=BL2 0.8V-IN2=BL3 0.8V-IN3=WL0 0.8V-IN4=WL1 0.8V-OUT1=BL2-SAFE 0.8V-OUT2=BL3-SAFE 0.8V-OUT3=WL0-SAFE 0.8V-OUT4=WL1-SAFE
U_Chip/U_ESD-0.8V: designators C64=C_U164 C65=C_U165 C66=C_U166 C67=C_U167 D1=D_U11 D2=D_U12 D3=D_U13 D4=D_U14 D5=D_U15 D6=D_U16 D7=D_U17 D8=D_U18 R27=R_U127 R28=R_U128 R29=R_U129 R30=R_U130; ports 0.8V-IN1=WL_MODE_1 0.8V-IN2=WL_MODE_2 0.8V-IN3=BL_MODE_1 0.8V-IN4=BL_MODE_2 0.8V-OUT1=WL_MODE_1-SAFE 0.8V-OUT2=WL_MODE_2-SAFE 0.8V-OUT3=BL_MODE_1-SAFE 0.8V-OUT4=BL_MODE_2-SAFE

### Notes on the sheet
- (near C64) 100pF C0G 0402
- (near C65) 100pF C0G 0402
- (near C66) 100pF C0G 0402
- (near C67) 100pF C0G 0402
- f_cutoff=1.06MHz for R=1.5kΩ, C=100pF

### Library data of the parts
C64-C67 = C0402C101J1GACAUTO: as C85 on sheet LDO; Package: None; Price: None; Value: *; MP: C0402C101J1GACAUTO; Availability: Unavailable
D1-D8 = BAT43WS-TP: Small Signal Schottky Diodes; Manufacturer_Name: MCC; Geometry.Height: 1.15mm; Mouser Part Number: 833-BAT43WS-TP; Mouser Price/Stock: https://www.mouser.co.uk/ProductDetail/Micro-Commercial-Components-MCC/BAT43WS-TP?qs=Vo7e0yZOYdELUvvmcALzzg%3D%3D; Manufacturer_Part_Number: BAT43WS-TP; Datasheet Link: https://www.mccsemi.com/pdf/Products/BAT42WS-BAT43WS(SOD-323).pdf
R27-R30 = RNCF0402DTE1K50: 1.5 kOhms ±0.5% 0.1W, 1/10W Chip Resistor 0402 (1005 Metric) Automotive AEC-Q200 Thin Film; Package: None; Price: None; Value: *; MP: RNCF0402DTE1K50; Availability: Unavailable